# EasyEDA Pro project RK3566_handy_V1.0.epro, schematic RK3566_2, sheets 9 to 13 of 25

## Sheets
9 Power_Charge: Assembly Variant: Basic; Board Name: RK3566主板; Create Date: 2026-09-20; Page Name: P2; Project Name: RK3566手机; Update Date: 2026-09-20
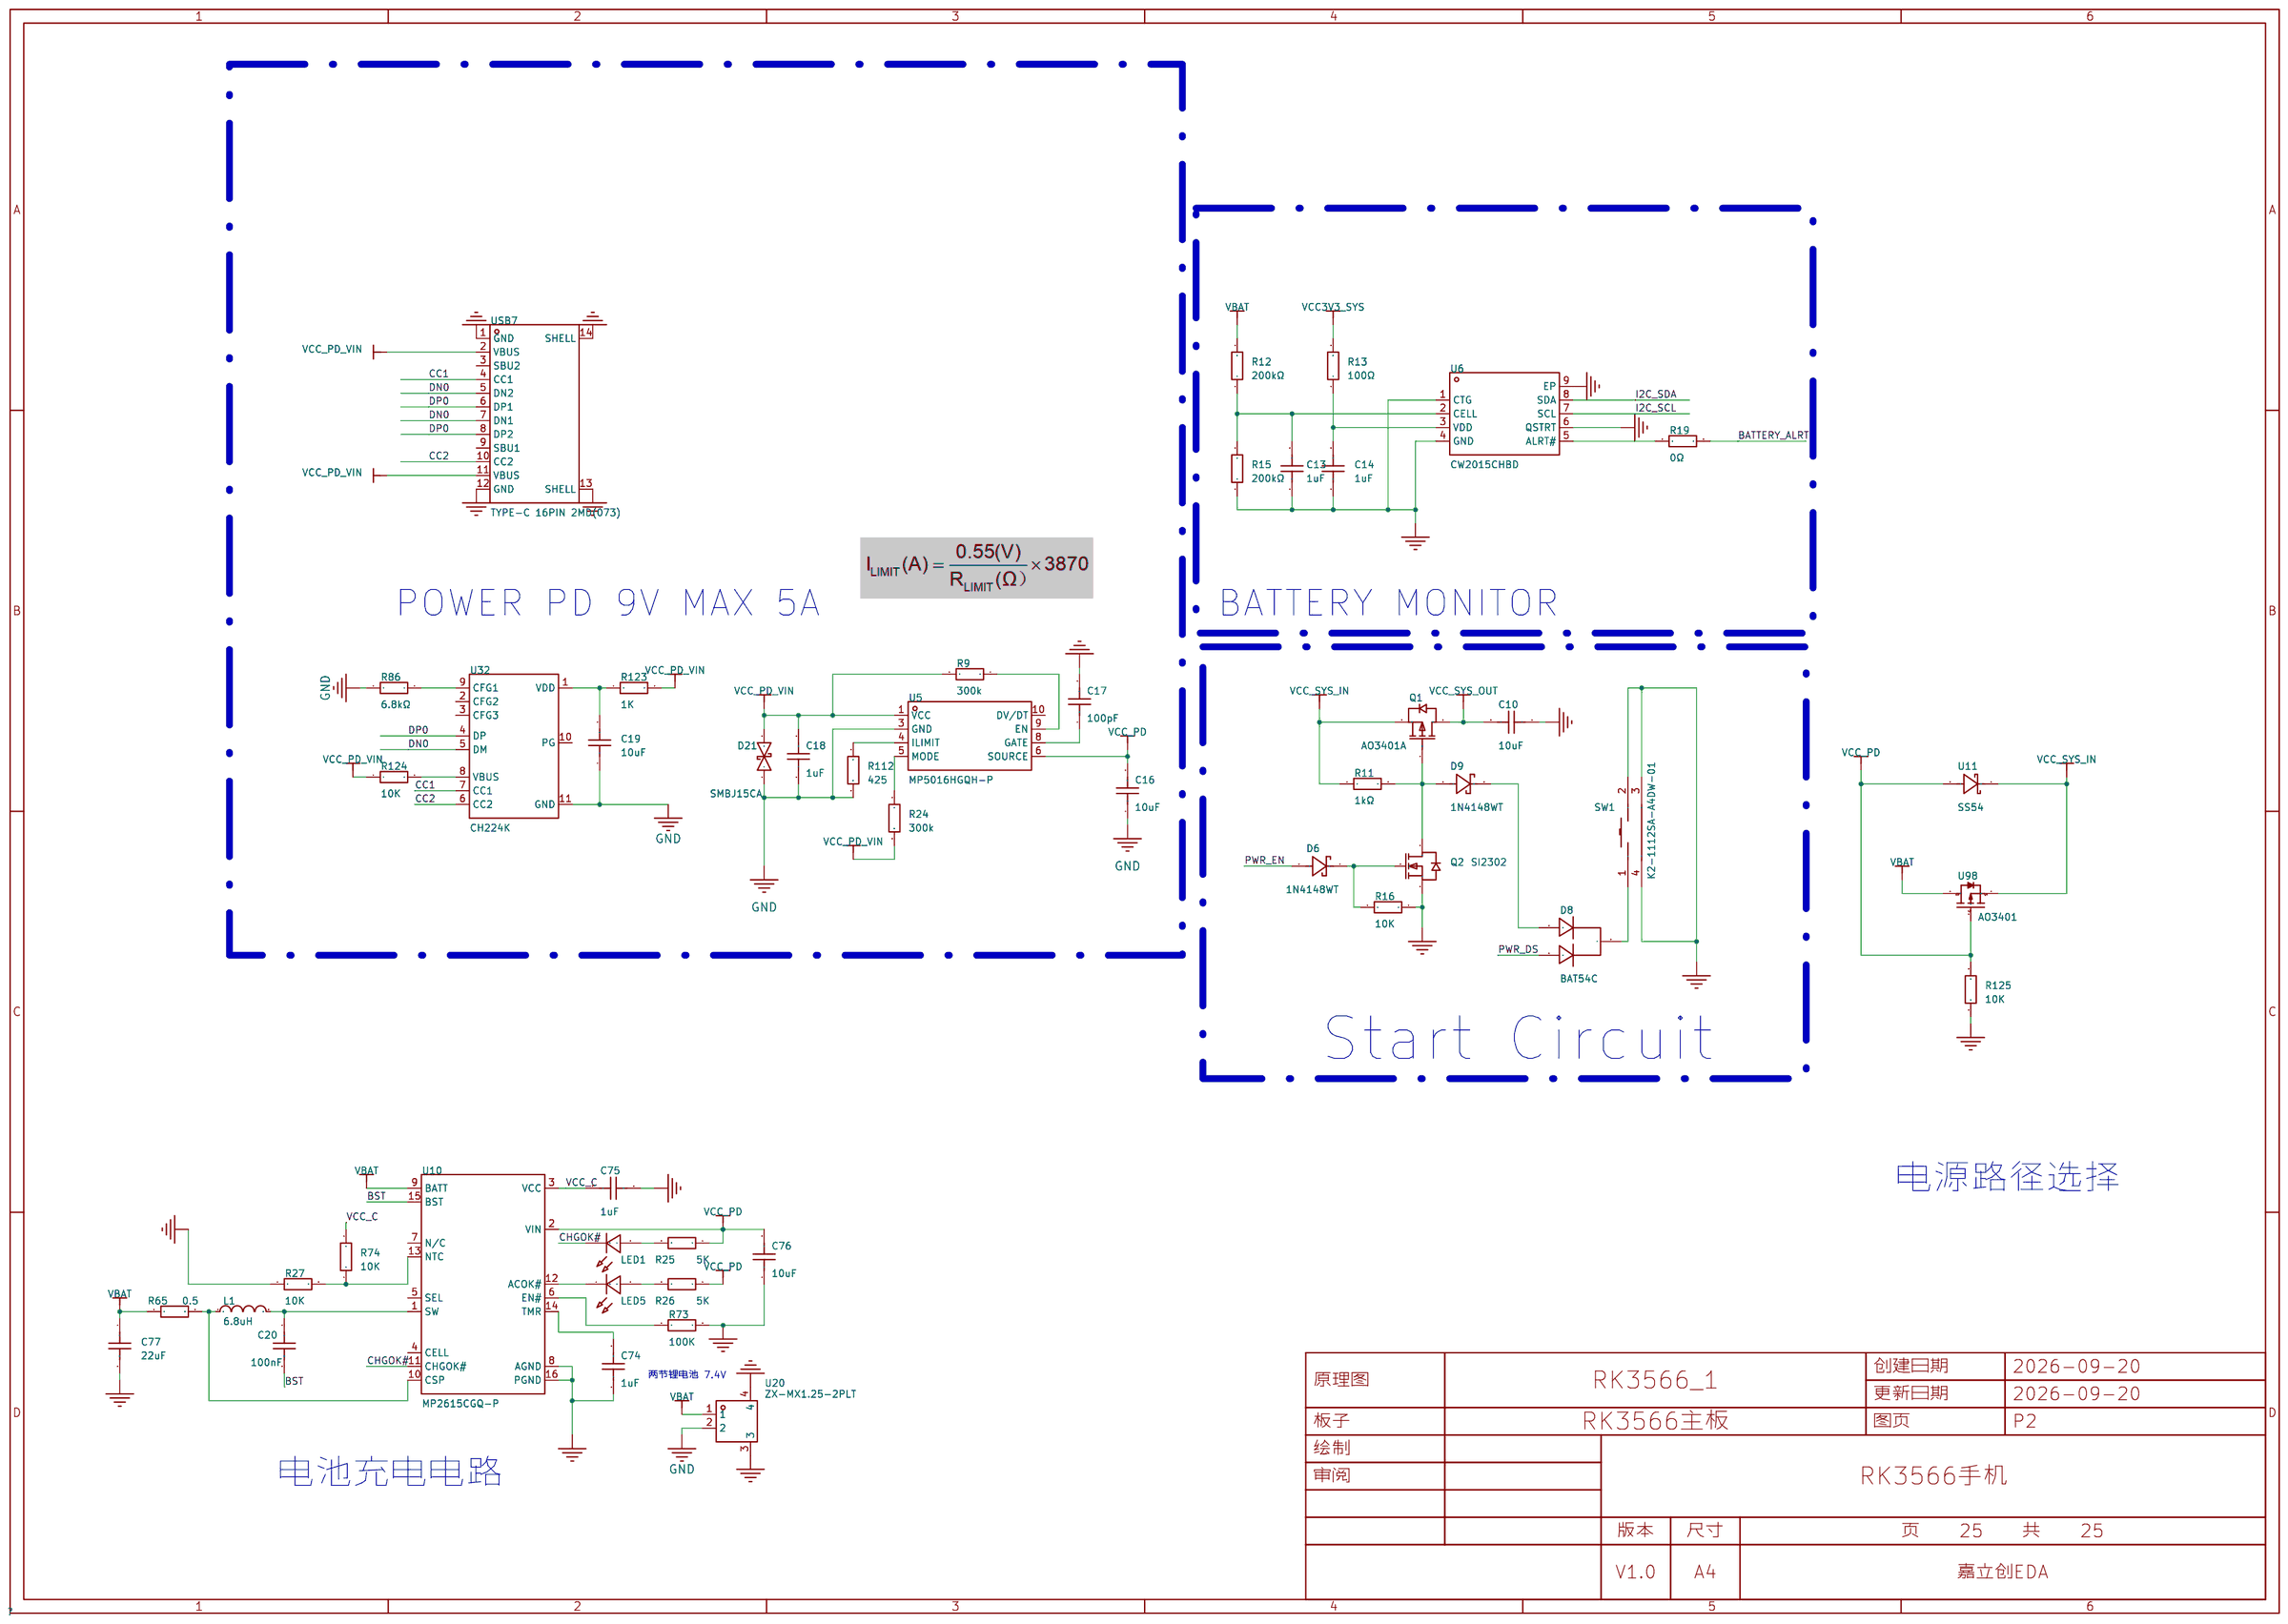
[diagram p8: Power_Charge]
10 MIPI_CSI: Create Date: 2026-09-20; Page Name: MIPI_CSI; Update Date: 2026-09-20
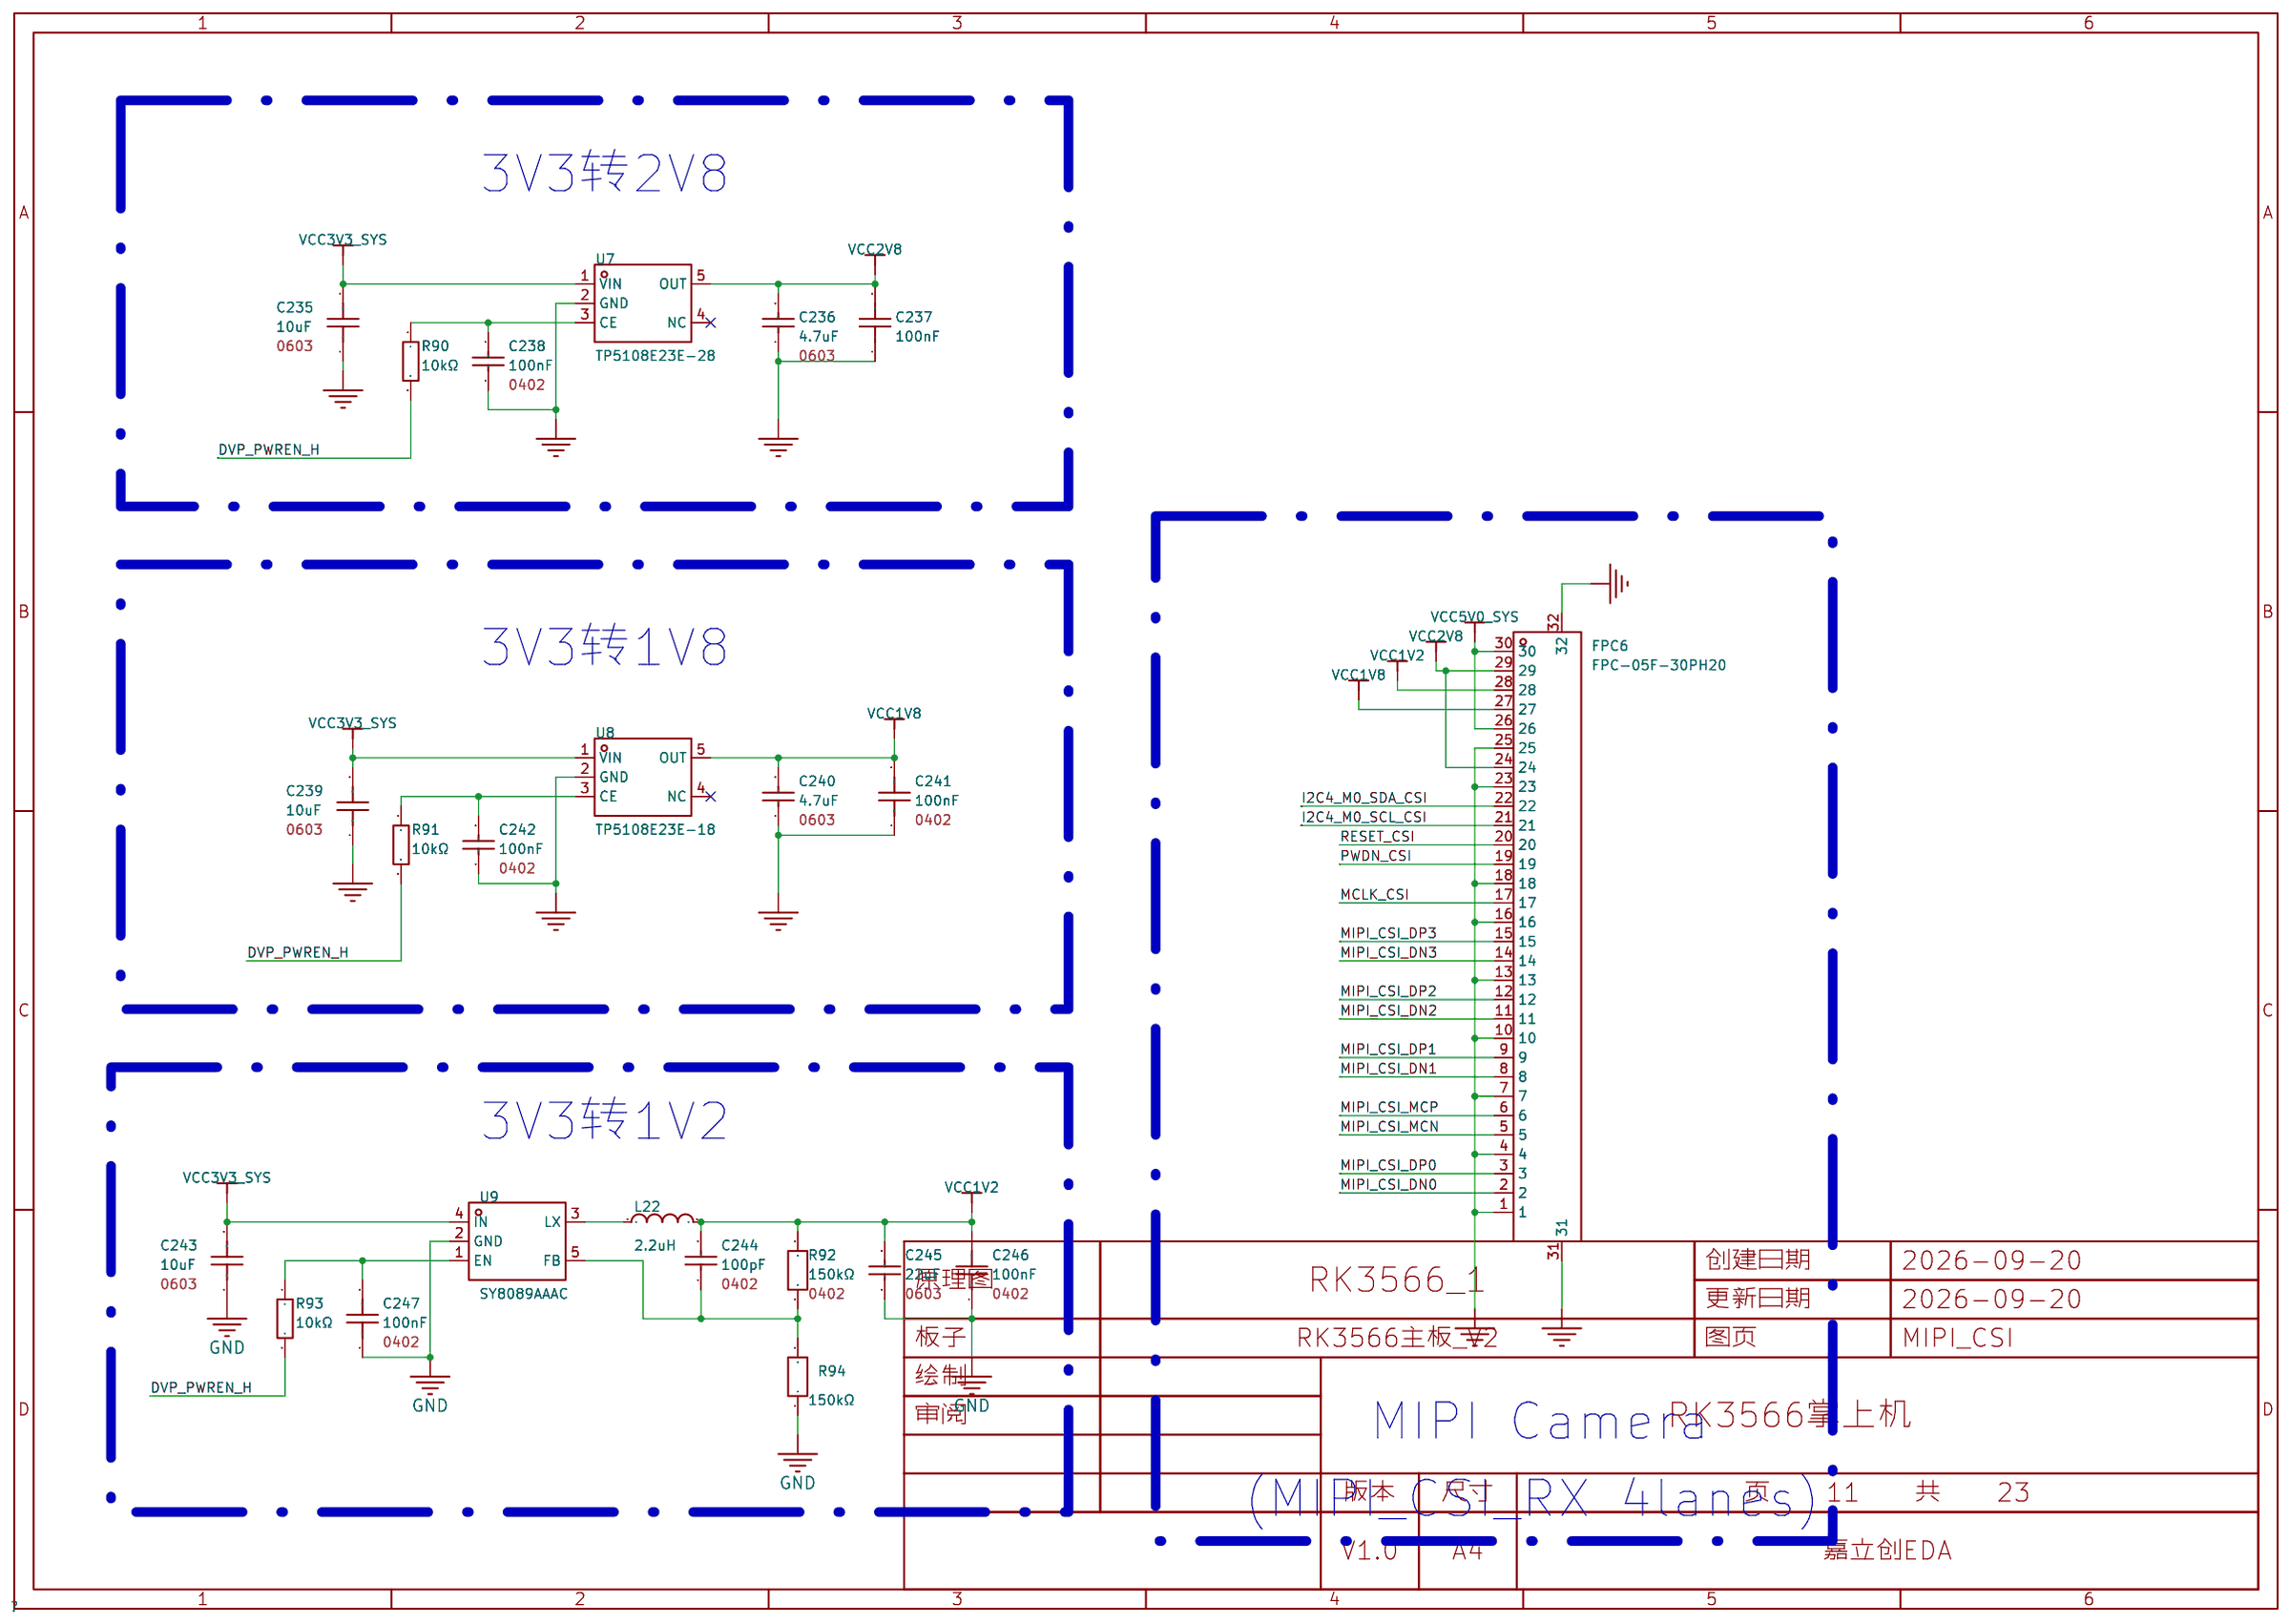
[diagram p9: MIPI_CSI]
11 RK3566_VI INTERFACE: Create Date: 2026-09-20; Page Name: RK3566_VI INTERFACE; Update Date: 2026-09-20
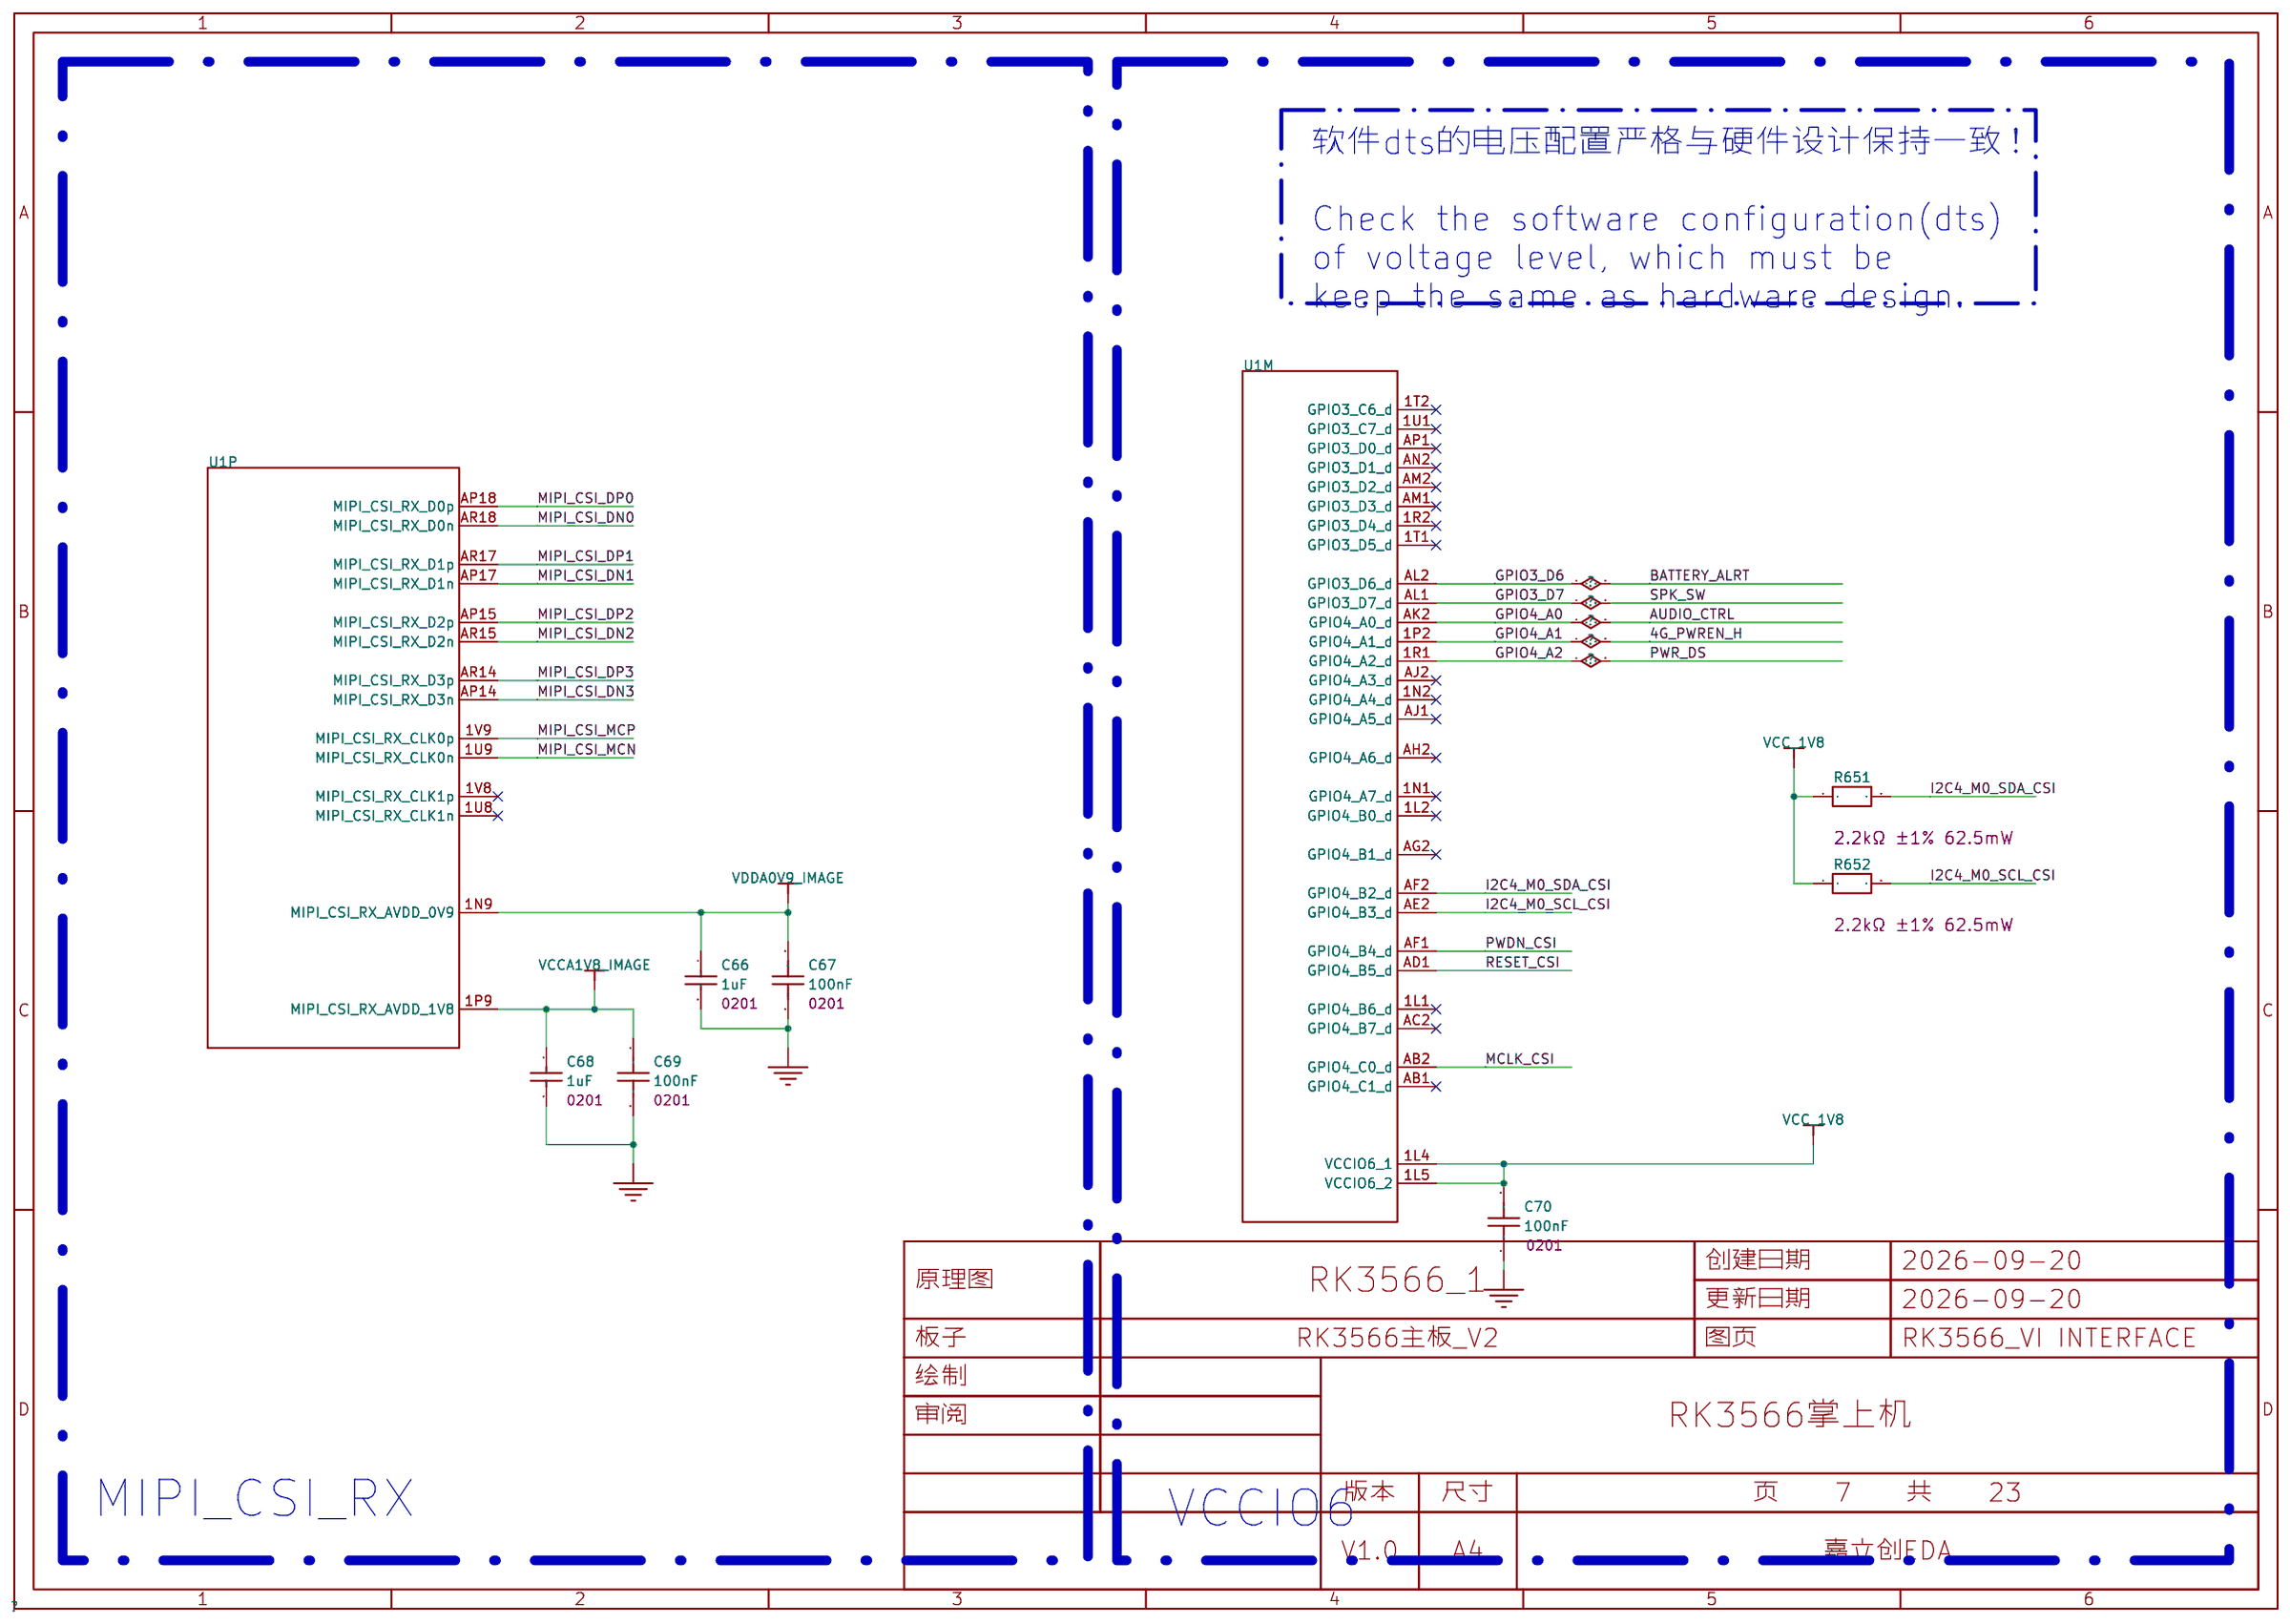
[diagram p10: RK3566_VI INTERFACE]
12 4G: Assembly Variant: Basic; Board Name: RK3566主板; Create Date: 2026-09-20; Page Name: P1; Project Name: RK3566手机; Update Date: 2026-09-20
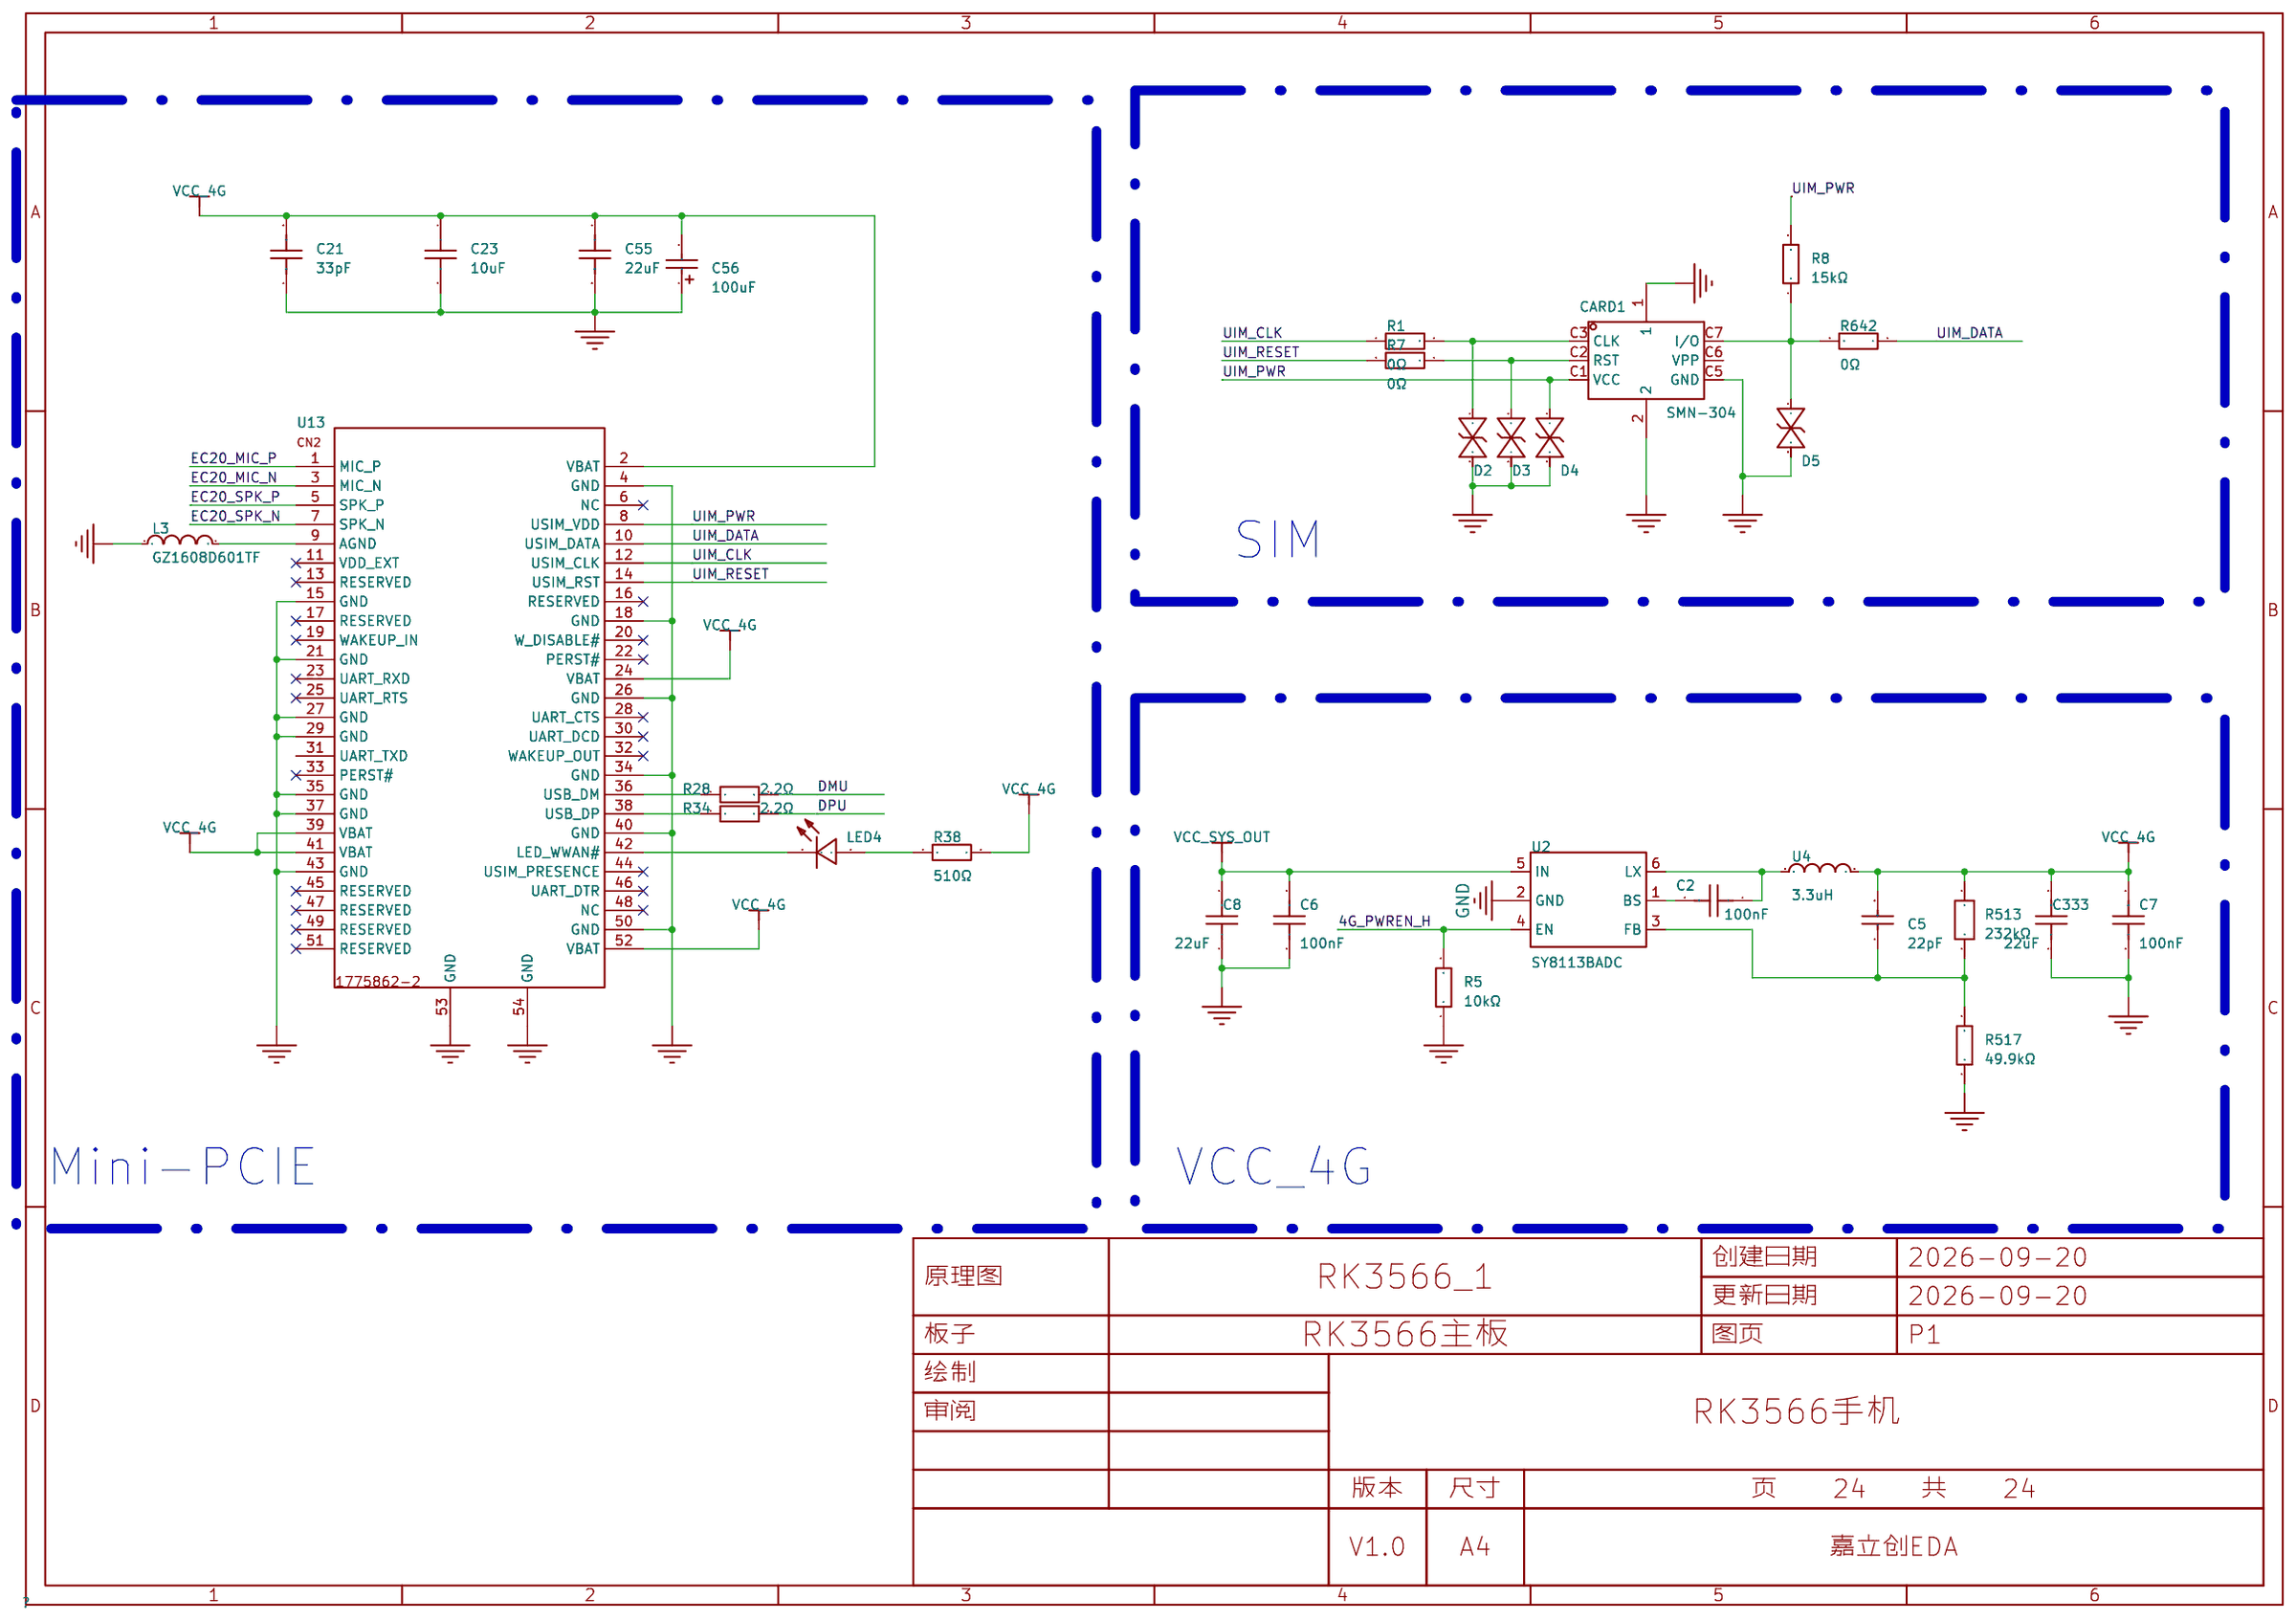
[diagram p11: 4G]
13 RK3566_SARADC/GPIO: Create Date: 2026-09-20; Page Name: RK3566_SARADC/GPIO; Update Date: 2026-09-20
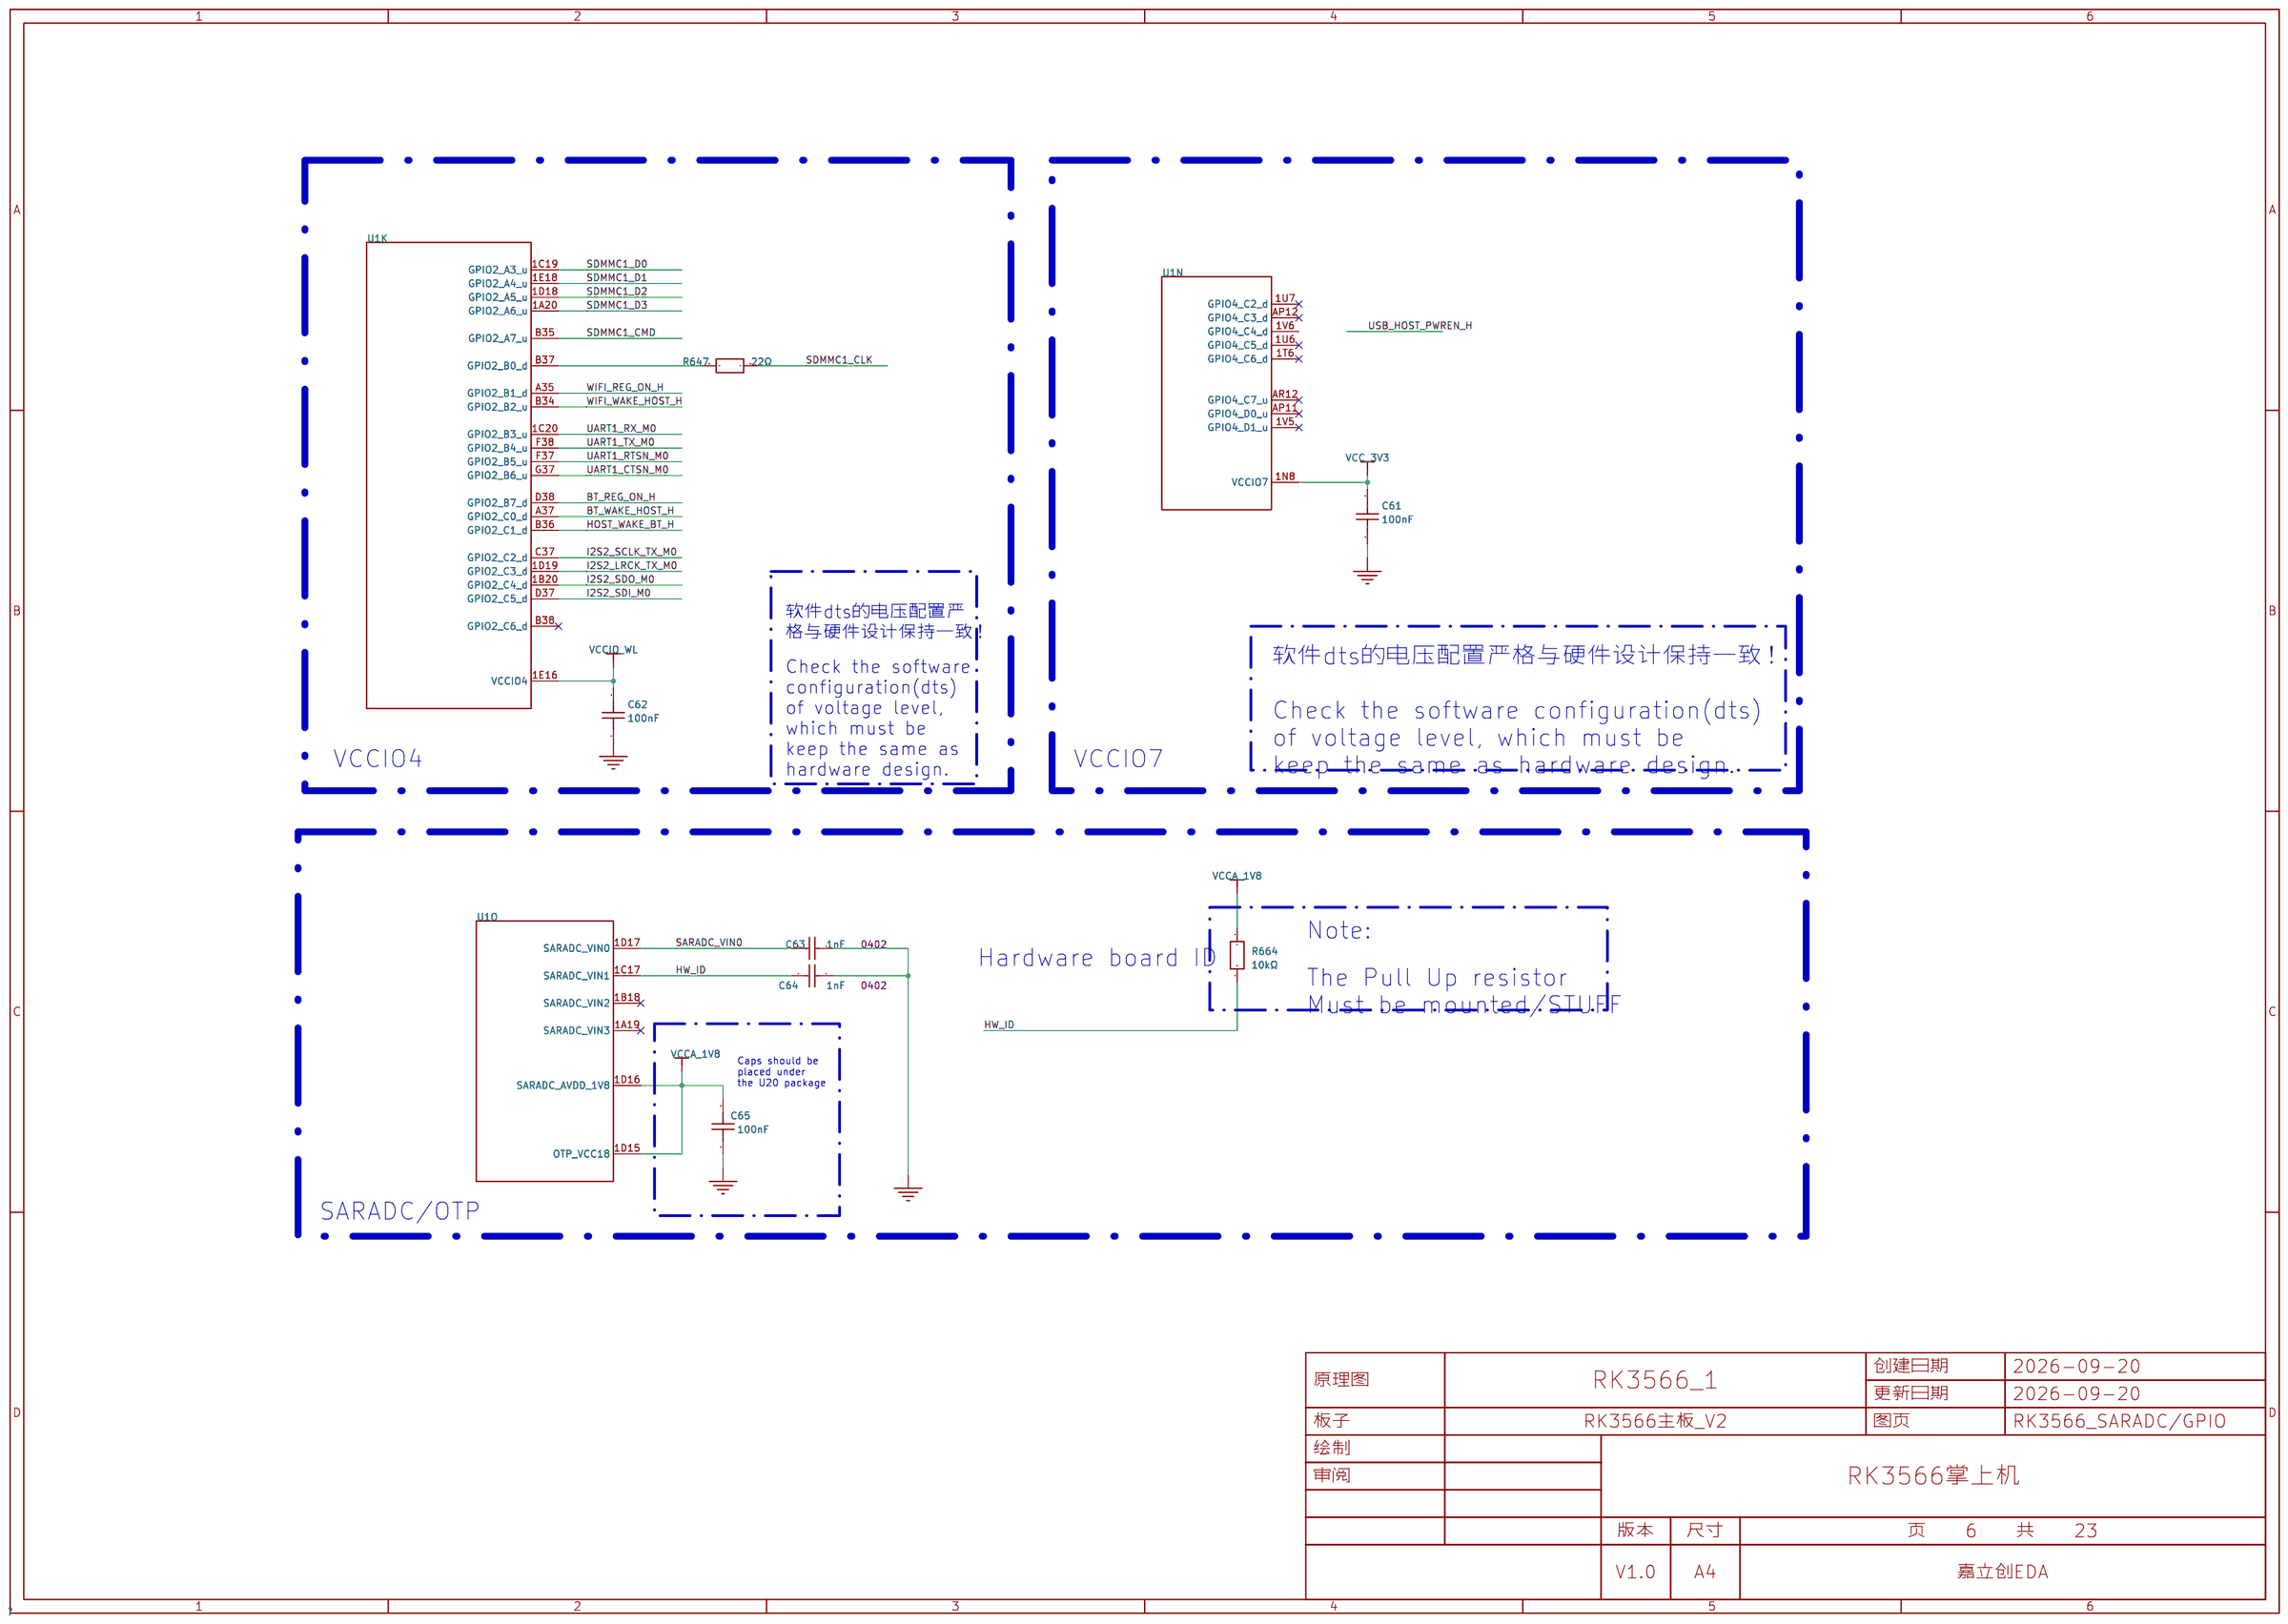
[diagram p12: RK3566_SARADC/GPIO]

## Parts
sheet 4G
C2  100nF  [c0402]
C5  22pF  [c0402]
C6  100nF  [c_0603]
C7  100nF  [c_0603]
C8  22uF  [c_0603]
C21  33pF  [C0402]
C23  10uF  [C0603]
C55  22uF  [C0603]
C56  100uF  [CASE-B_3528]
C333  22uF  [c_0603]
CARD1  SMN-304  [SIM-SMD_SMN-304]
D2  KLXES15AAA1  [r0402]
D3  KLXES15AAA1  [r0402]
D4  KLXES15AAA1  [r0402]
D5  KLXES15AAA1  [r0402]
L3  GZ1608D601TF  [L0603]
LED4  KT-0603B  [LED0603-RD]
R1  0Ω  [r0402]
R5  10kΩ  [r0402]
R7  0Ω  [r0402]
R8  15kΩ  [r0402]
R28  2.2Ω  [r0402]
R34  2.2Ω  [r0402]
R38  510Ω  [r0402]
R513  232kΩ  [r0402]
R517  49.9kΩ  [r0402]
R642  0Ω  [r0402]
U2  SY8113BADC  [TSOT-23-6_L2.9-W1.6-P0.95-LS2.8-BR]
U4  3.3uH  [IND-SMD_L2.5-W2.0]
U13  -  [MINI_PCIE]
sheet MIPI_CSI
C235  10uF  [LL_0603]
C236  4.7uF  [LL_0603]
C237  100nF  [LL_0402]
C238  100nF  [LL_0402]
C239  10uF  [LL_0603]
C240  4.7uF  [LL_0603]
C241  100nF  [LL_0402]
C242  100nF  [LL_0402]
C243  10uF  [LL_0603]
C244  100pF  [LL_0402]
C245  22uF  [LL_0603]
C246  100nF  [LL_0402]
C247  100nF  [LL_0402]
FPC6  FPC-05F-30PH20  [FPC-SMD_30P-P0.50_XUNPU_FPC-05F-30PH20]
L22  2.2uH  [IND-SMD_L2.5-W2.0_MHCHL2520]
R90  10kΩ  [LL_0402]
R91  10kΩ  [LL_0402]
R92  150kΩ  [LL_0402]
R93  10kΩ  [LL_0402]
R94  150kΩ  [LL_0402]
U7  TP5108E23E-28  [SOT-23-5_L3.0-W1.7-P0.95-LS2.8-BL]
U8  TP5108E23E-18  [SOT-23-5_L3.0-W1.7-P0.95-LS2.8-BL]
U9  SY8089AAAC  [SOT-23-5_L3.0-W1.7-P0.95-LS2.8-BR]
sheet Power_Charge
C10  10uF  [C0603]
C13  1uF  [c0402]
C14  1uF  [c0402]
C16  10uF  [C0603]
C17  100pF  [C0603]
C18  1uF  [C0603]
C19  10uF  [C0603]
C20  100nF  [C0603]
C74  1uF  [C0603]
C75  1uF  [C0603]
C76  10uF  [C0603]
C77  22uF  [C0603]
D6  1N4148WT  [SOD-523_L1.2-W0.8-LS1.6-RD]
D8  BAT54C  [SOT-23-3_L2.9-W1.3-P1.90-LS2.4-BR]
D9  1N4148WT  [SOD-523_L1.2-W0.8-LS1.6-RD]
D21  SMBJ15CA  [SMB_L4.6-W3.6-LS5.3-BI]
L1  6.8uH  [IND-SMD_L4.4-W4.2]
LED1  -  [LED_0603]
LED5  -  [LED_0603]
Q1  AO3401A  [SOT-23_L2.9-W1.3-P1.90-LS2.4-BR]
Q2  SI2302  [SOT-23-3_L2.9-W1.3-P1.90-LS2.4-BR]
R9  300k  [R0402]
R11  1kΩ  [R0402]
R12  200kΩ  [r0402]
R13  100Ω  [r0402]
R15  200kΩ  [r0402]
R16  10K  [R0402]
R19  0Ω  [r0402]
R24  300k  [R0402]
R25  5K  [R0603_1]
R26  5K  [R0603_1]
R27  10K  [R0603_1]
R65  0.5  [R1206]
R73  100K  [R0603_1]
R74  10K  [R0603_1]
R86  6.8kΩ  [R0402]
R112  425  [R0402]
R123  1K  [R0603]
R124  10K  [R0603]
R125  10K  [R0603]
SW1  K2-1112SA-A4DW-01  [KEY-TH_K2-1112SA-AXXW-XX]
U5  MP5016HGQH-P  [QFN-10_L2.0-W1.5-P0.5-BL_MP5016HGLH-Z]
U6  CW2015CHBD  [TDFN-8_L3.0-W2.0-P0.50-BL-EP]
U10  MP2615CGQ-P  [QFN-16_L3.0-W3.0-P0.5-BL_MP2615CGQ-P]
U11  SS54  [SMA_L4.2-W2.6-LS5.1-RD]
U20  ZX-MX1.25-2PLT  [CONN-SMD_2P-P1.25-MX1.25-2P-LT]
U32  CH224K  [ESSOP-10_L4.9-W3.9-P1.0-LS6.0-TL-EP]
U98  AO3401  [SOT-23-3_L2.9-W1.6-P1.90-LS2.8-BR]
USB7  TYPE-C 16PIN 2MD(073)  [USB-C-SMD_TYPE-C-6PIN-2MD-073]
sheet RK3566_POWER
U1  -  [BGA-565_L15.5-W14.4-P0.40_RK3566_1]  (sections 1,10,11,12,13,14,15,16,17,18,19,2,20,21,22,3,4,5,6,7,8,9)
sheet RK3566_SARADC/GPIO
C61  100nF  [CC_0201]
C62  100nF  [CC_0201]
C63  1nF  [CC0402]
C64  1nF  [CC0402]
C65  100nF  [CC_0201]
R647  22Ω  [LL_0402]
R664  10kΩ  [RR_0201]
sheet RK3566_VI INTERFACE
C66  1uF  [CC_0201]
C67  100nF  [CC_0201]
C68  1uF  [CC_0201]
C69  100nF  [CC_0201]
C70  100nF  [CC_0201]
R651  2.2kΩ  [RR_0402]
R652  2.2kΩ  [RR_0402]

## Library data of the parts
C2 C237 C241 = CL05B104KB54PNC: 容值:100nF;精度:±10%;额定电压:50V;温度系数:X7R;; LCSC Part Name: 100nF ±10% 50V; Supplier Part: C307331; Manufacturer: SAMSUNG(三星); Supplier Footprint: 0402; JLCPCB Part Class: 基础库; Datasheet: https://item.szlcsc.com/datasheet/CL05B104KB54PNC/291005.html; Supplier: LCSC; Tolerance: ±10%; Voltage Rating: 50V; Temperature Coefficient: X7R; Voltage Rated: 50V
C5 = 0402CG220J500NT: 容值:22pF;精度:±5%;额定电压:50V;材质(温度系数):C0G;; LCSC Part Name: 22pF ±5% 50V; Supplier Part: C1555; Manufacturer: FH(风华); Supplier Footprint: 0402; JLCPCB Part Class: Basic Part; Datasheet: https://atta.szlcsc.com/upload/public/pdf/source/20200305/C486355_26A10D38EF8C2A5C37091D0039909270.pdf; Supplier: LCSC; Tolerance: ±5%; Voltage Rated: 50V; Temperature Coefficient: C0G
C6 C7 = CC0603KRX7R9BB104: 容值:100nF;精度:±10%;额定电压:50V;材质(温度系数):X7R;; LCSC Part Name: 100nF ±10% 50V; Supplier Part: C14663; Manufacturer: YAGEO(国巨); Supplier Footprint: 0603; JLCPCB Part Class: Basic Part; Datasheet: https://atta.szlcsc.com/upload/public/pdf/source/20170116/1484561234239.pdf; Supplier: LCSC; Tolerance: ±10%; Voltage Rated: 50V; Temperature Coefficient: X7R
C8 C245 C333 = CL10A226MQ8NRNC: 容值:22uF;精度:±20%;额定电压:6.3V;材质(温度系数):X5R;; LCSC Part Name: 22uF ±20% 6.3V; Supplier Part: C59461; Manufacturer: SAMSUNG(三星); Supplier Footprint: 0603; JLCPCB Part Class: Basic Part; Datasheet: https://atta.szlcsc.com/upload/public/pdf/source/20160103/1457707740762.pdf; Supplier: LCSC; Tolerance: ±20%; Voltage Rated: 6.3V; Temperature Coefficient: X5R
C21 = FCC0402N330J500AT: 容值:33pF;精度:±5%;额定电压:50V;温度系数:C0G;; LCSC Part Name: 33pF ±5% 50V; Supplier Part: C5137486; Manufacturer: FOJAN(富捷); Supplier Footprint: 0402; JLCPCB Part Class: Extended Part; Datasheet: https://atta.szlcsc.com/upload/public/pdf/source/20220818/0EB3B7FB2F5648AC16609637FBA7DABE.pdf; Supplier: LCSC; Tolerance: ±5%; Voltage Rating: 50V; Temperature Coefficient: C0G
C10 C23 = CL10A106KP8NNNC: 容值:10uF;精度:±10%;额定电压:10V;温度系数:X5R;; LCSC Part Name: 10uF ±10% 10V; Supplier Part: C19702; Manufacturer: SAMSUNG(三星); Supplier Footprint: 0603; JLCPCB Part Class: Basic Part; Datasheet: https://item.szlcsc.com/datasheet/CL10A106KP8NNNC/20411.html; Supplier: LCSC; Tolerance: ±10%; Voltage Rated: 10V; Temperature Coefficient: X5R; Voltage Rating: 10V
C55 = CL10A226MP8NUNE: 容值:22uF;精度:±20%;额定电压:10V;温度系数:X5R;; LCSC Part Name: 22uF ±20% 10V; Supplier Part: C86295; Manufacturer: SAMSUNG(三星); Supplier Footprint: 0603; JLCPCB Part Class: Extended Part; Datasheet: https://item.szlcsc.com/datasheet/CL10A226MP8NUNE/87471.html; Supplier: LCSC; Tolerance: ±20%; Voltage Rating: 10V; Temperature Coefficient: X5R
C56 = TAJB107K006RNJ: 容值:100uF;精度:±10%;额定电压:6.3V;等效串联电阻(ESR):1.7Ω@100kHz;; LCSC Part Name: 100uF ±10% 6.3V; Supplier Part: C16133; Manufacturer: Kyocera AVX; Supplier Footprint: CASE-B-3528-21(mm); JLCPCB Part Class: Basic Part; Supplier: LCSC; Tolerance: ±10%; Voltage Rating: 6.3V; Equivalent Series Resistance(ESR): 1.7Ω@100kHz; Operating Temperature: -55℃~+125℃
CARD1 = SMN-304: 卡连接方式:拔插式;卡类型:NanoSIM卡;连接器类型:卡座;本体最大高度:1.35mm;触头材质:-;触头镀层:金;工作温度范围:-40℃~+85℃;焊接温度(最大值):260℃;; LCSC Part Name: 拔插式 NanoSIM卡 卡座; Supplier Part: C266889; Manufacturer: XUNPU(讯普); Supplier Footprint: SMD; JLCPCB Part Class: 扩展库; Datasheet: https://atta.szlcsc.com/upload/public/pdf/source/20210906/008C96EE0BDD3DBC40121ECB56D55849.pdf; Supplier: LCSC; Card Connection Mode: 拔插式; Card Type: NanoSIM卡; Connector Type: 卡座; Body Height (Max): 1.35mm; Contact Plating: 金; Operating Temperature Range: -40℃~+85℃; Welding Temperature (Max): 260℃; Check: false
D2-D5 = KLXES15AAA1: 极性:双向;反向截止电压(Vrwm):5V;钳位电压(Vc)@Ipp:40V;; Supplier Part: C2892490; Manufacturer: KUU; Supplier Footprint: 0402; JLCPCB Part Class: Extended Part; Datasheet: https://atta.szlcsc.com/upload/public/pdf/source/20210908/40FD94D5521B4EF0ED53BC030E77ED53.pdf; Supplier: LCSC; Polarity: 双向; Reverse Stand-Off Voltage (Vrwm): 5V; Clamping Voltage@Ipp: 40V; Check: false
L3 = GZ1608D601TF: 标称阻抗@测试频率:600Ω@100MHz;误差:±25%;直流电阻(RDC):450mΩ;; LCSC Part Name: 单路 0603磁珠 阻抗600Ω@100MHz; Supplier Part: C1002; Manufacturer: Sunlord(顺络); Supplier Footprint: 0603; JLCPCB Part Class: 基础库; Datasheet: https://atta.szlcsc.com/upload/public/pdf/source/20231030/9B6A3E87682CEC1FF6638DFAA81D73FA.pdf; Supplier: LCSC; Impedance @ Frequency: 600Ω@100MHz; Tolerance: ±25%; DC Resistance: 450mΩ; Current Rating: 200mA; Circuits: 1
LED4 = KT-0603B: 灯头类型:1.6mmx0.8mm方形灯头;发光颜色:蓝色;正向压降(Vf):3.1V;功率:100mW;正向电流:5mA;波长:460nm~475nm;二极管配置:独立二极管;透镜颜色:无色透明透镜;色温:-;发光强度:175mcd;发光角度:120°;载带方式:-;工作温度:-40℃~+85℃;; LCSC Part Name: 0603 蓝灯 高亮; Supplier Part: C2288; Manufacturer: KENTO; Supplier Footprint: 0603; JLCPCB Part Class: Extended Part; Datasheet: https://item.szlcsc.com/datasheet/KT-0603B/2661.html; Supplier: LCSC; Lamp Holder Type: 1.6mmx0.8mm方形灯头; Illumination Color: 蓝色; Voltage - Forward(Vf): 3.1V; Power(Watts): 100mW; Forward Current: 5mA; Wavelength - Dominant: 460nm~475nm; Peak Wavelength: 469nm; Diode Configuration: 独立二极管; Lens Color: 无色透明透镜; Luminous Intensity: 175mcd; Viewing Angle: 120°; Operating Temperature: -40℃~+85℃
R1 R7 R642 = RC0402JR-070RL: 电阻类型:厚膜电阻;阻值:0Ω;精度:±5%;功率:62.5mW;工作电压:50V;温度系数:-;; LCSC Part Name: 厚膜电阻 0Ω ±5% 62.5mW; Supplier Part: C60485; Manufacturer: YAGEO(国巨); Supplier Footprint: 0402; JLCPCB Part Class: 扩展库; Datasheet: https://atta.szlcsc.com/upload/public/pdf/source/20170428/1493376821999.pdf; Supplier: LCSC; Type: 厚膜电阻; Tolerance: ±5%; Power(Watts): 62.5mW; Voltage-Supply(Max): 50V; Operating Temperature: -55℃~+155℃
R5 = 0402WGF1002TCE: 电阻类型:厚膜电阻;阻值:10kΩ;精度:±1%;功率:62.5mW;; LCSC Part Name: 10kΩ ±1% 62.5mW; Supplier Part: C25744; Manufacturer: UNI-ROYAL(厚声); Supplier Footprint: 0402; JLCPCB Part Class: 基础库; Datasheet: https://atta.szlcsc.com/upload/public/pdf/source/20200306/C422600_1E6D84923E4A46A82E41ADD87F860B5C.pdf; Supplier: LCSC; Type: 厚膜电阻; Tolerance: ±1%; Power(Watts): 62.5mW; Temperature Coefficient: ±100ppm/℃; Overload Voltage (Max): 50V; Operating Temperature Range: -55℃~+155℃
R8 = RC0402FR-0715KL: 电阻类型:厚膜电阻;阻值:15kΩ;精度:±1%;功率:62.5mW;最大工作电压:50V;温度系数:±100ppm/℃;; LCSC Part Name: 厚膜电阻 15kΩ ±1% 62.5mW; Supplier Part: C114761; Manufacturer: YAGEO(国巨); Supplier Footprint: 0402; JLCPCB Part Class: 扩展库; Datasheet: https://atta.szlcsc.com/upload/public/pdf/source/20180821/C275644_0D56F95EFF785E7D9A1FEF436B37DA78.pdf; Supplier: LCSC; Type: 厚膜电阻; Tolerance: ±1%; Power(Watts): 62.5mW; Overload Voltage (Max): 50V; Temperature Coefficient: ±100ppm/℃; Operating Temperature Range: -55℃~+155℃
R28 R34 = 0402WGF220KTCE: 电阻类型:厚膜电阻;阻值:2.2Ω;精度:±1%;功率:62.5mW;最大工作电压:50V;温度系数:±200ppm/℃;; LCSC Part Name: 2.2Ω ±1% 62.5mW 厚膜电阻; Supplier Part: C25101; Manufacturer: UNI-ROYAL(厚声); Supplier Footprint: 0402; JLCPCB Part Class: 扩展库; Datasheet: https://atta.szlcsc.com/upload/public/pdf/source/20200306/C422600_1E6D84923E4A46A82E41ADD87F860B5C.pdf; Supplier: LCSC; Type: 厚膜电阻; Tolerance: ±1%; Power(Watts): 62.5mW; Overload Voltage (Max): 50V; Temperature Coefficient: ±200ppm/℃; Operating Temperature Range: -55℃~+155℃
R38 = 0402WGF5100TCE: 电阻类型:厚膜电阻;阻值:510Ω;精度:±1%;功率:62.5mW;最大工作电压:50V;温度系数:±100ppm/℃;; LCSC Part Name: 510Ω ±1% 62.5mW 厚膜电阻; Supplier Part: C25123; Manufacturer: UNI-ROYAL(厚声); Supplier Footprint: 0402; JLCPCB Part Class: Basic Part; Datasheet: https://atta.szlcsc.com/upload/public/pdf/source/20200306/C422600_1E6D84923E4A46A82E41ADD87F860B5C.pdf; Supplier: LCSC; Type: 厚膜电阻; Tolerance: ±1%; Power(Watts): 62.5mW; Overload Voltage (Max): 50V; Temperature Coefficient: ±100ppm/℃; Operating Temperature Range: -55℃~+155℃; Check: false
R513 = FRC0402F2323TS: 电阻类型:厚膜电阻;阻值:232kΩ;精度:±1%;功率:62.5mW;工作电压:50V;温度系数:±100ppm/℃;; LCSC Part Name: 232kΩ ±1% 62.5mW 厚膜电阻; Supplier Part: C3013159; Manufacturer: FOJAN(富捷); Supplier Footprint: 0402; JLCPCB Part Class: 扩展库; Supplier: LCSC; Type: 厚膜电阻; Tolerance: ±1%; Power(Watts): 62.5mW; Voltage-Supply(Max): 50V; Temperature Coefficient: ±100ppm/℃; Operating Temperature: -55℃~+155℃
R517 = 0402WGF4992TCE: 电阻类型:厚膜电阻;阻值:49.9kΩ;精度:±1%;功率:62.5mW;工作电压:50V;温度系数:±100ppm/℃;; LCSC Part Name: 49.9kΩ ±1% 62.5mW 厚膜电阻; Supplier Part: C25897; Manufacturer: UNI-ROYAL(厚声); Supplier Footprint: 0402; JLCPCB Part Class: 扩展库; Datasheet: https://item.szlcsc.com/datasheet/0402WGF4992TCE/26640.html; Supplier: LCSC; Type: 厚膜电阻; Tolerance: ±1%; Power(Watts): 62.5mW; Voltage-Supply(Max): 50V; Temperature Coefficient: ±100ppm/℃; Operating Temperature: -55℃~+155℃
U2 = SY8113BADC: 功能类型:降压型;输出类型:可调;工作电压:4.5V~18V;输出电压:-;输出电流:3A;; LCSC Part Name: 高效率500kHz 3A 18V输入同步降压转换器; Supplier Part: C78989; Manufacturer: Silergy(矽力杰); Supplier Footprint: TSOT-23-6; JLCPCB Part Class: 扩展库; Datasheet: https://item.szlcsc.com/datasheet/SY8113BADC/80126.html; Supplier: LCSC; Function: 降压型; Output Type: 可调; Voltage - Supply: 4.5V~18V; Output Current: 3A; Frequency - Switching: 500kHz; Operating Temperature: -40℃~+125℃@(TJ); Synchronous Rectifier: 是; Number of Outputs: 1; Topology: 降压式; Quiescent Current: 100uA; Switch tube (built-in/external): 内置; Input Voltage: 4.5V~18V; Switching Frequency: 500kHz; Synchronous Rectification: 是; Quiescent Current (Iq): 100uA
U4 = FTC252012S3R3MBCA: 电感值:3.3uH;精度:±20%;额定电流:2.3A;饱和电流(Isat):3A;类型:-;; LCSC Part Name: 3.3uH ±20% 3A; Supplier Part: C5832373; Manufacturer: cjiang(长江微电); Supplier Footprint: 1008; JLCPCB Part Class: 扩展库; Datasheet: https://item.szlcsc.com/datasheet/FTC252012S3R3MBCA/6763493.html; Supplier: LCSC; Tolerance: ±20%; Current Rating: 2.3A; Current - Saturation(Isat): 3A; DC Resistance(DCR): 80mΩ
U13 = PCIE
C235 C239 C243 = CL10A106KP8NNNC: 容值:10uF;精度:±10%;额定电压:10V;材质(温度系数):X5R;; LCSC Part Name: 10uF ±10% 10V; Supplier Part: C19702; Manufacturer: SAMSUNG(三星); Supplier Footprint: 0603; JLCPCB Part Class: Basic Part; Datasheet: https://atta.szlcsc.com/upload/public/pdf/source/20160103/1457707703378.pdf; Supplier: LCSC; Tolerance: ±10%; Voltage Rated: 10V; Temperature Coefficient: X5R
C236 C240 = CL10A475KO8NNNC: 容值:4.7uF;精度:±10%;额定电压:16V;温度系数:X5R;; LCSC Part Name: 4.7uF ±10% 16V; Supplier Part: C19666; Manufacturer: SAMSUNG(三星); Supplier Footprint: 0603; JLCPCB Part Class: 基础库; Datasheet: https://item.szlcsc.com/datasheet/CL10A475KO8NNNC/20375.html; Supplier: LCSC; Tolerance: ±10%; Voltage Rating: 16V; Temperature Coefficient: X5R; Voltage Rated: 16V
C238 C242 = CL05B104KO5NNNC: 容值:100nF;精度:±10%;额定电压:16V;材质(温度系数):X7R;; LCSC Part Name: 100nF ±10% 16V; Supplier Part: C1525; Manufacturer: SAMSUNG(三星); Supplier Footprint: 0402; JLCPCB Part Class: 基础库; Datasheet: https://atta.szlcsc.com/upload/public/pdf/source/20160103/1457707674891.pdf; Supplier: LCSC; Tolerance: ±10%; Voltage Rated: 16V; Temperature Coefficient: X7R
C244 = 0402CG101J500NT: 容值:100pF;精度:±5%;额定电压:50V;材质(温度系数):C0G;; LCSC Part Name: 100pF±5%50V; Supplier Part: C1546; Manufacturer: FH(风华); Supplier Footprint: 0402; JLCPCB Part Class: BasicPart; Datasheet: https://atta.szlcsc.com/upload/public/pdf/source/20170923/C1546_1506149265265988353.pdf; Supplier: LCSC; Tolerance: ±5%; Voltage Rated: 50V; Temperature Coefficient: C0G
C246 C247 = CL05B104KB54PNC: 容值:100nF;精度:±10%;额定电压:50V;温度系数:X7R;; LCSC Part Name: 100nF±10%50V; Supplier Part: C307331; Manufacturer: SAMSUNG(三星); Supplier Footprint: 0402; JLCPCB Part Class: 基础库; Datasheet: https://item.szlcsc.com/datasheet/CL05B104KB54PNC/291005.html; Supplier: LCSC; Tolerance: ±10%; Voltage Rating: 50V; Temperature Coefficient: X7R; Voltage Rated: 50V
FPC6 = FPC-05F-30PH20: 间距:0.5mm;触点数量:30;锁定特性:翻盖式;安装类型:卧贴;触点类型:下接;工作温度范围:-25℃~+85℃;; LCSC Part Name: 0.5mm P数:30 翻盖式 下接; Supplier Part: C2856808; Manufacturer: XUNPU(讯普); Supplier Footprint: SMD,P=0.5mm; JLCPCB Part Class: 扩展库; Datasheet: https://atta.szlcsc.com/upload/public/pdf/source/20210922/C2856808_4E6DDE2793CFD9EF09B771A8BD3338A4.pdf; Supplier: LCSC; Pitch: 0.5mm; Number of Contacts: 30; Locking Feature: 翻盖式; Mounting Type: 卧贴; Contact Type: 下接; Height Above Board: 2mm; FFC, FCB Thickness: 0.3mm; Operating Temperature Range: -25℃~+85℃
L22 = FTC252012S2R2MBCA: 电感值:2.2uH;精度:±20%;额定电流:3A;饱和电流(Isat):3.8A;类型:一体成型电感;; LCSC Part Name: 2.2uH ±20% 3.8A; Supplier Part: C5832372; Manufacturer: cjiang(长江微电); Supplier Footprint: 1008; JLCPCB Part Class: 扩展库; Datasheet: https://atta.szlcsc.com/upload/public/pdf/source/20230602/8FFEDA9C0247A92A0D4B67554BFE4091.pdf; Supplier: LCSC; Tolerance: ±20%; Rated Current: 3A; Saturation Current (Isat): 3.8A; DC Resistance (DCR): 55mΩ; Type: 一体成型电感
R90 R91 = CRCW040210K0FKED: 电阻类型:厚膜电阻;阻值:10kΩ;精度:±1%;功率:63mW;温度系数:±100ppm/K;最大工作电压:50V;工作温度范围:-55℃~+155℃;; LCSC Part Name: 10kΩ ±1% 63mW; Supplier Part: C71617; Manufacturer: VISHAY(威世); Supplier Footprint: 0402; JLCPCB Part Class: 扩展库; Datasheet: https://atta.szlcsc.com/upload/public/pdf/source/20180224/C71617_15194370300791364062.pdf; Supplier: LCSC; Type: 厚膜电阻; Tolerance: ±1%; Power(Watts): 63mW; Temperature Coefficient: ±100ppm/K; Overload Voltage (Max): 50V; Operating Temperature Range: -55℃~+155℃
R92 R94 = ERJ2RKF1503X: 电阻类型:厚膜电阻;阻值:150kΩ;精度:±1%;功率:100mW;温度系数:±100ppm/℃;最大工作电压:-;工作温度范围:-55℃~+155℃;; LCSC Part Name: 150kΩ±1%100mW; Supplier Part: C413108; Manufacturer: PANASONIC(松下); Supplier Footprint: 0402; JLCPCB Part Class: ExtendedPart; Datasheet: https://atta.szlcsc.com/upload/public/pdf/source/20190820/C413108_ED933EFC858348C528DF7AE0A9A6E4FB.pdf; Supplier: LCSC; Type: 厚膜电阻; Tolerance: ±1%; Power(Watts): 100mW; Temperature Coefficient: ±100ppm/℃; Operating Temperature Range: -55℃~+155℃
R93 = CRCW040210K0FKED: 电阻类型:厚膜电阻;阻值:10kΩ;精度:±1%;功率:63mW;温度系数:±100ppm/K;最大工作电压:50V;工作温度范围:-55℃~+155℃;; LCSC Part Name: 10kΩ±1%63mW; Supplier Part: C71617; Manufacturer: VISHAY(威世); Supplier Footprint: 0402; JLCPCB Part Class: 扩展库; Datasheet: https://atta.szlcsc.com/upload/public/pdf/source/20180224/C71617_15194370300791364062.pdf; Supplier: LCSC; Type: 厚膜电阻; Tolerance: ±1%; Power(Watts): 63mW; Temperature Coefficient: ±100ppm/K; Overload Voltage (Max): 50V; Operating Temperature Range: -55℃~+155℃
U7 = TP5108E23E-28: 输出类型:-;; Supplier Part: C907864; Manufacturer: TECH PUBLIC(台舟); Supplier Footprint: SOT-23-5; JLCPCB Part Class: 扩展库; Datasheet: https://atta.szlcsc.com/upload/public/pdf/source/20210810/00BCEBA398DE9B0CD0F512A883B75AB3.pdf; Supplier: LCSC
U8 = TP5108E23E-18: 输出类型:-;; Supplier Part: C907845; Manufacturer: TECH PUBLIC(台舟); Supplier Footprint: SOT-23-5; JLCPCB Part Class: Extended Part; Datasheet: https://atta.szlcsc.com/upload/public/pdf/source/20210810/AA08377C81F8353E2F8C5F8FC160FE00.pdf; Supplier: LCSC
U9 = SY8089AAAC: 功能类型:降压型;同步整流:-;输出通道数:-;拓扑结构:-;输入电压:-;输出电流(最大值):-;开关频率:-;; LCSC Part Name: 降压型; Supplier Part: C78988; Manufacturer: silergy(矽力杰); Supplier Footprint: SOT-23-5; JLCPCB Part Class: Extended Part; Datasheet: https://atta.szlcsc.com/upload/public/pdf/source/20210826/394049C81A2AF57A190C26FDBC282657.pdf; Supplier: LCSC; Function: 降压型
C13 C14 = CL05A105KA5NQNC: 容值:1uF;精度:±10%;额定电压:25V;温度系数:X5R;; LCSC Part Name: 1uF ±10% 25V; Supplier Part: C52923; Manufacturer: SAMSUNG(三星); Supplier Footprint: 0402; JLCPCB Part Class: Basic Part; Datasheet: https://item.szlcsc.com/datasheet/CL05A105KA5NQNC/53938.html; Supplier: LCSC; Tolerance: ±10%; Voltage Rating: 25V; Temperature Coefficient: X5R; Voltage Rated: 25V
C16-C20 C74-C77 = CAP_0603: Supplier Footprint: 0603
D6 D9 = 1N4148WT_C727112: 二极管配置:独立式;正向压降(Vf):1.25V@150mA;直流反向耐压(Vr):75V;平均整流电流(Io):125mA;反向恢复时间(trr):4ns;; LCSC Part Name: 电压:75V 电流:125mA; Supplier Part: C727112; Manufacturer: TWGMC(台湾迪嘉); Supplier Footprint: SOD-523; JLCPCB Part Class: 扩展库; Datasheet: https://atta.szlcsc.com/upload/public/pdf/source/20200828/C727112_FCA71CBB186A515518FBD85DA79D41CF.pdf; Supplier: LCSC; Diode Configuration: 独立式; Forward Voltage (Vf@If): 1.25V@150mA; Reverse Voltage (Vr): 75V; Average Rectified Current (Io): 125mA; Reverse Leakage Current: 1uA@75V; Reverse Recovery Time (trr): 4ns; Operating Temperature: -65℃~+150℃@(Tj)
D8 = BAT54C: Supplier Part: C9900013520; Supplier Footprint: SOT-23; Supplier: LCSC
D21 = SMBJ15CA: 反向截止电压(Vrwm):15V;钳位电压:24.4V;峰值脉冲电流(Ipp):24.6A;击穿电压:16.7V;; Supplier Part: C330064; Manufacturer: JJW(捷捷微); Supplier Footprint: SMB; JLCPCB Part Class: 扩展库; Datasheet: https://atta.szlcsc.com/upload/public/pdf/source/20181224/C338783_C30EB8BBB8C528D881F4F6A96936F798.pdf; Supplier: LCSC; Reverse Stand-Off Voltage (Vrwm): 15V; Clamping Voltage: 24.4V; Peak Pulse Current (Ipp): 24.6A; Voltage - Breakdown: 16.7V; Type: TVS
L1 = FXL0420-6R8-M: 电感值:6.8uH;精度:±20%;额定电流:2.4A;饱和电流(Isat):2.5A;; LCSC Part Name: 6.8uH ±20% 2.5A; Supplier Part: C177241; Manufacturer: cjiang(长江微电); Supplier Footprint: SMD,4.2x4.4mm; JLCPCB Part Class: 扩展库; Datasheet: https://atta.szlcsc.com/upload/public/pdf/source/20190322/C177241_926E0DC8333CBC0DC90F3B0802D0087D.pdf; Supplier: LCSC; Tolerance: ±20%; Rated Current: 2.4A; Saturation Current (Isat): 2.5A; DC Resistance (DCR): 160mΩ
LED1 = LED_0603-G: Supplier Footprint: 0603
LED5 = LED_0603-B: Supplier Footprint: 0603
Q1 = AO3401A_C15127: 数量:1个P沟道;漏源电压(Vdss):30V;连续漏极电流(Id):4A;导通电阻(RDS(on)):47mΩ@10V；85mΩ@2.5V；60mΩ@4.5V;耗散功率(Pd):-;阈值电压(Vgs(th)):900mV@250uA;; LCSC Part Name: 1个P沟道 耐压:30V 电流:4A; Supplier Part: C15127; Manufacturer: AOS; Supplier Footprint: SOT-23; JLCPCB Part Class: Basic Part; Datasheet: https://item.szlcsc.com/datasheet/AO3401A/15801.html; Supplier: LCSC; Drain Source Voltage (Vdss): 30V; Continuous Drain Current (Id): 4A; Power Dissipation (Pd): 1.4W; Drain Source On Resistance (RDS(on)@Vgs,Id): 44mΩ@10V,4.3A; Gate Threshold Voltage (Vgs(th)@Id): 1.3V@250uA; Total Gate Charge (Qg@Vgs): 12.2nC@4.5V; Input Capacitance (Ciss@Vds): 1.2nF@15V; Number: 1个P沟道; Drain to Source Voltage: 30V; Current - Continuous Drain(Id): 4A; RDS(on): 47mΩ@10V；85mΩ@2.5V；60mΩ@4.5V; Gate Threshold Voltage (Vgs(th)): 900mV@250uA; Gate Charge(Qg): 14nC@10V; Input Capacitance(Ciss): 645pF; Reverse Transfer Capacitance (Crss@Vds): 55pF; Output Capacitance(Coss): 80pF
Q2 = SI2302: 类型:N沟道;漏源电压(Vdss):20V;连续漏极电流(Id):2.6A;功率(Pd):900mW;导通电阻(RDS(on)@Vgs,Id):85mΩ@4.5V,2.6A;阈值电压(Vgs(th)@Id):1.5V@250uA;栅极电荷(Qg@Vgs):-;输入电容(Ciss@Vds):880pF@6V;反向传输电容(Crss@Vds):-;工作温度:+150℃@(Tj);; LCSC Part Name: N沟道 20V 2.6A; Supplier Part: C2841377; Manufacturer: TECH PUBLIC(台舟); Supplier Footprint: SOT-23-3; JLCPCB Part Class: 扩展库; Datasheet: https://atta.szlcsc.com/upload/public/pdf/source/20210810/B45106B571BB908B9120BCB1C1283335.pdf; Supplier: LCSC; Type: N沟道; Drain Source Voltage (Vdss): 20V; Continuous Drain Current (Id): 2.6A; Power Dissipation (Pd): 900mW; Drain Source On Resistance (RDS(on)@Vgs,Id): 85mΩ@4.5V,2.6A; Gate Threshold Voltage (Vgs(th)@Id): 1.5V@250uA; Input Capacitance (Ciss@Vds): 880pF@6V; Operating Temperature: +150℃@(Tj)
R9 R16 R24 R112 = Res_0402: Supplier Footprint: 0402
R11 = RC0402FR-07232KL: 电阻类型:厚膜电阻;阻值:232kΩ;精度:±1%;功率:62.5mW;; LCSC Part Name: 232kΩ ±1% 62.5mW; Supplier Part: C309542; Manufacturer: YAGEO(国巨); Supplier Footprint: 0402; JLCPCB Part Class: Extended Part; Datasheet: https://atta.szlcsc.com/upload/public/pdf/source/20181009/C309542_CA3F4488430805647C87B9489F02B718.pdf; Supplier: LCSC; Type: 厚膜电阻; Tolerance: ±1%; Power(Watts): 62.5mW; Temperature Coefficient: ±100ppm/℃; Overload Voltage (Max): 50V; Operating Temperature Range: -55℃~+155℃
R12 R15 = 0402WGF2003TCE: 电阻类型:厚膜电阻;阻值:200kΩ;精度:±1%;功率:62.5mW;最大工作电压:50V;温度系数:±100ppm/℃;; LCSC Part Name: 200kΩ ±1% 62.5mW 厚膜电阻; Supplier Part: C25764; Manufacturer: UNI-ROYAL(厚声); Supplier Footprint: 0402; JLCPCB Part Class: 基础库; Datasheet: https://atta.szlcsc.com/upload/public/pdf/source/20200306/C422600_1E6D84923E4A46A82E41ADD87F860B5C.pdf; Supplier: LCSC; Type: 厚膜电阻; Tolerance: ±1%; Power(Watts): 62.5mW; Overload Voltage (Max): 50V; Temperature Coefficient: ±100ppm/℃; Operating Temperature Range: -55℃~+155℃
R13 = 0402WGF1000TCE: 电阻类型:厚膜电阻;阻值:100Ω;精度:±1%;功率:62.5mW;最大工作电压:50V;温度系数:±200ppm/℃;; LCSC Part Name: 100Ω ±1% 62.5mW 厚膜电阻; Supplier Part: C25076; Manufacturer: UNI-ROYAL(厚声); Supplier Footprint: 0402; JLCPCB Part Class: 基础库; Datasheet: https://atta.szlcsc.com/upload/public/pdf/source/20200306/C422600_1E6D84923E4A46A82E41ADD87F860B5C.pdf; Supplier: LCSC; Type: 厚膜电阻; Tolerance: ±1%; Power(Watts): 62.5mW; Overload Voltage (Max): 50V; Temperature Coefficient: ±200ppm/℃; Operating Temperature Range: -55℃~+155℃
R19 = 0402WGF0000TCE: 电阻类型:厚膜电阻;阻值:0Ω;精度:±1%;功率:62.5mW;; LCSC Part Name: 0Ω ±1% 62.5mW; Supplier Part: C17168; Manufacturer: UNI-ROYAL(厚声); Supplier Footprint: 0402; JLCPCB Part Class: 基础库; Datasheet: https://atta.szlcsc.com/upload/public/pdf/source/20200306/C422600_1E6D84923E4A46A82E41ADD87F860B5C.pdf; Supplier: LCSC; Type: 厚膜电阻; Tolerance: ±1%; Power(Watts): 62.5mW; Temperature Coefficient: ±800ppm/℃; Overload Voltage (Max): 50V; Operating Temperature Range: -55℃~+155℃
R25-R27 R73 R74 = Res_604: Supplier Footprint: 0603
R65 = Res_1206: Supplier Footprint: 1206
R86 = 0402WGF2402TCE: 电阻类型:厚膜电阻;阻值:24kΩ;精度:±1%;功率:62.5mW;最大工作电压:50V;温度系数:±100ppm/℃;; LCSC Part Name: 24kΩ ±1% 62.5mW 厚膜电阻; Supplier Part: C25769; Manufacturer: UNI-ROYAL(厚声); Supplier Footprint: 0402; JLCPCB Part Class: Extended Part; Datasheet: https://atta.szlcsc.com/upload/public/pdf/source/20200306/C422600_1E6D84923E4A46A82E41ADD87F860B5C.pdf; Supplier: LCSC; Type: 厚膜电阻; Tolerance: ±1%; Power(Watts): 62.5mW; Overload Voltage (Max): 50V; Temperature Coefficient: ±100ppm/℃; Operating Temperature Range: -55℃~+155℃
R123-R125 = Res_0603: Supplier Footprint: 0603
SW1 = K2-1112SA-A4DW-01: 作用力:2.5N;安装方式:卧贴;开关长度:7mm;开关宽度:3.5mm;开关高度:3.5mm;触点电流:50mA;额定电压:12V;工作寿命:10万次;; LCSC Part Name: 3*6侧按键高寿命双弹片; Supplier Part: C961745; Manufacturer: 韩国韩荣; Supplier Footprint: SMD,7x3.5mm; JLCPCB Part Class: Extended Part; Datasheet: https://item.szlcsc.com/datasheet/K2-1112SA-A4DW-01/1041850.html; Supplier: LCSC; Operating Force: 2.5N; Mounting Type: 卧贴; Length: 7mm; Width: 3.5mm; Switch Height: 3.5mm; Contact Current: 50mA; Voltage Rating: 12V; Life: 10万次; Operating Temperature: -25℃~+85℃
U5 = MP5016HGQH-P: 通道数:1;输出电流:5A;输入电压:22V;导通电阻:43mΩ;; Supplier Part: C17511186; Manufacturer: MPS(芯源); Supplier Footprint: QFN-10(1.5x2); JLCPCB Part Class: Extended Part; Datasheet: https://atta.szlcsc.com/upload/public/pdf/source/20240129/A0473F64F2AD80E8863A1DB9ED91C917.pdf; Supplier: LCSC; Number of Outputs: 1; Output Current: 5A; Input Voltage: 22V; Resistor On-State: 43mΩ; Operating Temperature	-: -40℃~+125℃
U6 = CW2015CHBD: Supplier Part: C881838; Manufacturer: Cellwise(赛微); Supplier Footprint: TDFN-8-EP(2x3); JLCPCB Part Class: 扩展库; Datasheet: https://atta.szlcsc.com/upload/public/pdf/source/20210512/C881838_09B0689D9538DF441B283DD8D668F2A7.pdf; Supplier: LCSC
U10 = MP2615CGQ-P: 工作电压:18V;最大充电电流:2.1A;电池类型:-;电池节数:1~2;; LCSC Part Name: 2.1A,1-电池或2-电池锂离子电池充电器; Supplier Part: C3682629; Supplier Footprint: QFN-16(3x3); JLCPCB Part Class: Extended Part; Datasheet: https://item.szlcsc.com/datasheet/MP2615CGQ-P/4250434.html; Supplier: LCSC; Voltage - Supply: 18V; Charge Current - Max: 2.1A; Number of Cells: 1~2; Operating Temperature: -40℃~+85℃
U11 = SS54: Supplier Part: C9900023219; Supplier Footprint: (1N5824)DO-214; JLCPCB Part Class: 扩展库; Supplier: LCSC
U20 = ZX-MX1.25-2PLT: 插针结构:1x2P;间距:1.25mm;安装方式:立贴;参考系列:PicoBlade(MX 1.25);总PIN数:2P;排数:1;每排PIN数:2;行距:-;额定电流:1A;触头材质:黄铜;触头镀层:锡;工作温度:-25℃~+85℃;; LCSC Part Name: 1x2P 间距:1.25mm 立贴 系列:PicoBlade(MX 1.25); Supplier Part: C7430473; Manufacturer: Megastar(兆星); Supplier Footprint: SMD,P=1.25mm; JLCPCB Part Class: Extended Part; Datasheet: https://item.szlcsc.com/datasheet/ZX-MX1.25-2PLT/8430342.html; Supplier: LCSC; Pins Structure: 1x2P; Pitch: 1.25mm; Mounting Type: 立贴; Reference Series: PicoBlade(MX 1.25); Number of Pins: 2P; Number of Rows: 1; Number of PINs Per Row: 2; Current Rating: 1A; Contact Material: 黄铜; Contact Plating: 锡; Operating Temperature: -25℃~+85℃; Voltage Rating: 125V; Plastic Material: LCP; Supplementary Features: 辅助焊脚; Color: 米色; Z-Height of the Board: 4.7mm; X-Length of Bottom Edge on Board (Spacing Line): 7.5mm; Y-Width of Bottom Edge on Board: 4.3mm
U32 = CH224K: 应用功能:USB充电芯片;; LCSC Part Name: USB PD等多快充协议受电芯片CH224; Supplier Part: C970725; Manufacturer: WCH(南京沁恒); Supplier Footprint: ESSOP-10-150mil-1mm; JLCPCB Part Class: 扩展库; Datasheet: https://atta.szlcsc.com/upload/public/pdf/source/20240313/43C2AFDDBDD1F65B60386D2CCAB0811B.pdf; Supplier: LCSC; Applications Function: USB充电芯片
U98 = AO3401: Supplier Part: C9900008520; Supplier Footprint: SOT-23; JLCPCB Part Class: 扩展库; Supplier: LCSC
USB7 = TYPE-C 16PIN 2MD(073): 连接器类型:Type-C;协议标准:USB 3.1;公母:母;安装方式:卧贴;触点数量:16P;端口数量:1;额定电流 - 电源:3A;工作温度:-25℃~+85℃;; LCSC Part Name: Type-C 母 卧贴; Supplier Part: C2765186; Manufacturer: SHOU HAN(首韩); Supplier Footprint: SMD; JLCPCB Part Class: 扩展库; Datasheet: https://item.szlcsc.com/datasheet/TYPE-C%252016PIN%25202MD(073)/2901843.html; Supplier: LCSC; Connector Type: Type-C; Protocol Standard: USB 3.1; Gender: 母; Mounting Type: 卧贴; Number of Contacts: 16P; Number of Ports: 1; Current Rating-Power: 3A; Voltage Rating: 5V; Connect-Disconnect Life: 5千次; Detection color: 黑色; Operating Temperature: -25℃~+85℃
U1 = RK3566
C61 C62 C65 C67 C69 C70 = CL03A104KO3NNNC: 容值:100nF;精度:±10%;额定电压:16V;材质(温度系数):X5R;; LCSC Part Name: 100nF ±10% 16V; Supplier Part: C307380; Manufacturer: SAMSUNG(三星); Supplier Footprint: 0201; JLCPCB Part Class: Extended Part; Datasheet: https://atta.szlcsc.com/upload/public/pdf/source/20181009/C307380_E0679AAF9658ADA26DBF30CED0CA6925.pdf; Supplier: LCSC; Tolerance: ±10%; Voltage Rated: 16V; Temperature Coefficient: X5R
C63 C64 = CL05B102KB5NNNC: 容值:1nF;精度:±10%;额定电压:50V;材质(温度系数):X7R;; LCSC Part Name: 1nF ±10% 50V; Supplier Part: C14442; Manufacturer: SAMSUNG(三星); Supplier Footprint: 0402; JLCPCB Part Class: 扩展库; Datasheet: https://atta.szlcsc.com/upload/public/pdf/source/20160103/1457707670498.pdf; Supplier: LCSC; Tolerance: ±10%; Voltage Rated: 50V; Temperature Coefficient: X7R
R647 = 0402WGF220JTCE: 电阻类型:厚膜电阻;阻值:22Ω;精度:±1%;功率:62.5mW;温度系数:±100ppm/℃;; LCSC Part Name: 厚膜电阻 22Ω ±1% 62.5mW; Supplier Part: C25092; Manufacturer: UNI-ROYAL(厚声); Supplier Footprint: 0402; JLCPCB Part Class: Basic Part; Datasheet: https://atta.szlcsc.com/upload/public/pdf/source/20200306/C422600_1E6D84923E4A46A82E41ADD87F860B5C.pdf; Supplier: LCSC; Type: 厚膜电阻; Tolerance: ±1%; Power(Watts): 62.5mW; Temperature Coefficient: ±100ppm/℃; Overload Voltage (Max): 50V; Operating Temperature Range: -55℃~+155℃
R664 = FRC0201J103 TS: 电阻类型:厚膜电阻;阻值:10kΩ;精度:±5%;功率:50mW;温度系数:±200ppm/℃;; LCSC Part Name: 厚膜电阻 10kΩ ±5% 50mW; Supplier Part: C7467266; Manufacturer: FOJAN(富捷); Supplier Footprint: 0201; JLCPCB Part Class: 扩展库; Datasheet: https://item.szlcsc.com/datasheet/FRC0201J103%2520TS/8513882.html; Supplier: LCSC; Type: 厚膜电阻; Tolerance: ±5%; Power(Watts): 50mW; Temperature Coefficient: ±200ppm/℃
C66 C68 = CL03A105MQ3CSNH: 容值:1uF;精度:±20%;额定电压:6.3V;材质(温度系数):X5R;; LCSC Part Name: 1uF ±20% 6.3V; Supplier Part: C53067; Manufacturer: SAMSUNG(三星); Supplier Footprint: 0201; JLCPCB Part Class: Extended Part; Datasheet: https://atta.szlcsc.com/upload/public/pdf/source/20160103/1457707736151.pdf; Supplier: LCSC; Tolerance: ±20%; Voltage Rated: 6.3V; Temperature Coefficient: X5R
R651 R652 = 0402WGF2201TCE: 电阻类型:厚膜电阻;阻值:2.2kΩ;精度:±1%;功率:62.5mW;; LCSC Part Name: 2.2kΩ ±1% 62.5mW; Supplier Part: C25879; Manufacturer: UNI-ROYAL(厚声); Supplier Footprint: 0402; JLCPCB Part Class: Basic Part; Datasheet: https://atta.szlcsc.com/upload/public/pdf/source/20200306/C422600_1E6D84923E4A46A82E41ADD87F860B5C.pdf; Supplier: LCSC; Type: 厚膜电阻; Tolerance: ±1%; Power(Watts): 62.5mW; Temperature Coefficient: ±100ppm/℃; Overload Voltage (Max): 50V; Operating Temperature Range: -55℃~+155℃

## Nets
GND: C6.1 C7.1 C8.1 C10.1 C13.1 C14.1 C16.1 C17.2 C18.1 C19.1 C21.1 C23.2 C55.2 C56.1 C61.1 C62.1 C63.2 C64.2 C65.1 C66.2 C67.1 C68.2 C69.1 C70.1 C74.1 C75.1 C76.1 C77.2 C235.1 C236.1 C237.1 C238.1 C239.1 C240.1 C241.1 C242.1 C243.1 C245.1 C246.1 C247.1 C333.1 CARD1.1 CARD1.2 CARD1.C5(GND) D2.2(A) D3.2(A) D4.2(A) D5.2(A) D21.1(K) FPC6.1 FPC6.4 FPC6.7 FPC6.10 FPC6.13 FPC6.16 FPC6.18 FPC6.23 FPC6.25 FPC6.31 FPC6.32 L3.1 Q2.2(S) R5.1 R15.1 R16.1 R27.1 R73.2 R86.2 R94.1 R112.1 R125.1 R517.1 SW1.2 SW1.3 SW1.4 U2.2(GND) U5.3(GND) U6.1(CTG) U6.4(GND) U6.6(QSTRT) U6.9(EP) U7.2(GND) U8.2(GND) U9.2(GND) U10.8(AGND) U10.16(PGND) U13.4(GND) U13.15(GND) U13.18(GND) U13.21(GND) U13.26(GND) U13.27(GND) U13.29(GND) U13.34(GND) U13.35(GND) U13.37(GND) U13.40(GND) U13.43(GND) U13.50(GND) U13.53(GND) U13.54(GND) U20.2 U20.3 U20.4 U32.11(GND) USB7.1(GND) USB7.12(GND) USB7.13(SHELL) USB7.14(SHELL) ; also on sheet 1 2 3 4 5 6 7 8 14 15 16 17 18 19 20 21 22 23 24 25
VBAT: C77.1 R12.2 R65.1 U10.9(BATT) U20.1 U98.3(D)
VCC1V2: C244.2 C245.2 C246.2 FPC6.28 L22.2 R92.2
VCC1V8: C240.2 C241.2 FPC6.27 U8.5(OUT)
VCC2V8: C236.2 C237.2 FPC6.24 FPC6.29 U7.5(OUT)
VCC3V3_SYS: C235.2 C239.2 C243.2 R13.2 U7.1(VIN) U8.1(VIN) U9.4(IN) ; also on sheet 20 21 22 23
VCC5V0_SYS: FPC6.26 FPC6.30 ; also on sheet 6 7 19 20 21 22
VCC_1V8: C70.2 R651.1 R652.1 U1.1L4(VCCIO6_1) U1.1L5(VCCIO6_2) ; also on sheet 21 22
VCC_3V3: C61.2 U1.1N8(VCCIO7) ; also on sheet 7 8 15 16 17 21 22 25
VCC_4G: C5.2 C7.2 C21.2 C23.1 C55.1 C56.2 C333.2 R38.2 R513.2 U4.2 U13.2(VBAT) U13.24(VBAT) U13.39(VBAT) U13.41(VBAT) U13.52(VBAT)
VCC_C: C75.2 R74.2 U10.3(VCC)
VCC_PD: C16.2 C76.2 R25.1 R26.1 R125.2 U5.6(SOURCE) U10.2(VIN) U11.2(A) U98.1(G)
VCC_PD_VIN: C18.2 D21.2(A) R9.2 R24.2 R123.2 R124.1 U5.1(VCC) USB7.2(VBUS) USB7.11(VBUS)
VCC_SYS_IN: Q1.2(S) R11.1 U11.1(C) U98.2(S)
VCC_SYS_OUT: C6.2 C8.2 C10.2 Q1.3(D) U2.5(IN) ; also on sheet 21
VCCA1V8_IMAGE: C68.1 C69.2 U1.1P9(MIPI_CSI_RX_AVDD_1V8) ; also on sheet 4 22
VCCA_1V8: C65.2 R664.2 U1.1D15(OTP_VCC18) U1.1D16(SARADC_AVDD_1V8) ; also on sheet 8 14 19 22
VCCIO_WL: C62.2 U1.1E16(VCCIO4) ; also on sheet 21 22 23
VDDA0V9_IMAGE: C66.1 C67.2 U1.1N9(MIPI_CSI_RX_AVDD_0V9) ; also on sheet 4 22
4G_PWREN_H: R5.2 U1.1P2(GPIO4_A1_d) U2.4(EN)
AUDIO_CTRL: U1.AK2(GPIO4_A0_d) ; also on sheet 20
BATTERY_ALRT: R19.2 U1.AL2(GPIO3_D6_d)
BST: C20.2 U10.15(BST)
BT_REG_ON_H: U1.D38(GPIO2_B7_d) ; also on sheet 23
BT_WAKE_HOST_H: U1.A37(GPIO2_C0_d) ; also on sheet 23
CC1: U32.7(CC1) USB7.4(CC1)
CC2: U32.6(CC2) USB7.10(CC2)
CHGOK#: LED1.1(C) U10.11(CHGOK#)
DMU: R28.2 ; also on sheet 8
DN0: U32.5(DM) USB7.5(DN2) USB7.7(DN1)
DP0: U32.4(DP) USB7.6(DP1) USB7.8(DP2)
DPU: R34.2 ; also on sheet 8
DVP_PWREN_H: R90.2 R91.2 R93.2 ; also on sheet 14
EC20_MIC_N: U13.3(MIC_N) ; also on sheet 20
EC20_MIC_P: U13.1(MIC_P) ; also on sheet 20
EC20_SPK_N: U13.7(SPK_N) ; also on sheet 20
EC20_SPK_P: U13.5(SPK_P) ; also on sheet 20
GPIO0_A5: D6.2(A) ; also on sheet 14
GPIO3_D7: U1.AL1(GPIO3_D7_d) ; also on sheet 20
GPIO4_A2: D8.2(A2) U1.1R1(GPIO4_A2_d)
HOST_WAKE_BT_H: U1.B36(GPIO2_C1_d) ; also on sheet 23
HW_ID: C64.1 R664.1 U1.1C17(SARADC_VIN1)
I2C1_SCL_TP: U6.8(SDA) ; also on sheet 7 14 17
I2C1_SDA_TP: U6.7(SCL) ; also on sheet 7 14 17
I2C4_M0_SCL_CSI: FPC6.21 R652.2 U1.AE2(GPIO4_B3_d)
I2C4_M0_SDA_CSI: FPC6.22 R651.2 U1.AF2(GPIO4_B2_d)
I2S2_LRCK_TX_M0: U1.1D19(GPIO2_C3_d) ; also on sheet 23
I2S2_SCLK_TX_M0: U1.C37(GPIO2_C2_d) ; also on sheet 23
I2S2_SDI_M0: U1.D37(GPIO2_C5_d) ; also on sheet 23
I2S2_SDO_M0: U1.1B20(GPIO2_C4_d) ; also on sheet 23
MCLK_CSI: FPC6.17 U1.AB2(GPIO4_C0_d)
MIPI_CSI_DN0: FPC6.2 U1.AR18(MIPI_CSI_RX_D0n)
MIPI_CSI_DN1: FPC6.8 U1.AP17(MIPI_CSI_RX_D1n)
MIPI_CSI_DN2: FPC6.11 U1.AR15(MIPI_CSI_RX_D2n)
MIPI_CSI_DN3: FPC6.14 U1.AP14(MIPI_CSI_RX_D3n)
MIPI_CSI_DP0: FPC6.3 U1.AP18(MIPI_CSI_RX_D0p)
MIPI_CSI_DP1: FPC6.9 U1.AR17(MIPI_CSI_RX_D1p)
MIPI_CSI_DP2: FPC6.12 U1.AP15(MIPI_CSI_RX_D2p)
MIPI_CSI_DP3: FPC6.15 U1.AR14(MIPI_CSI_RX_D3p)
MIPI_CSI_MCN: FPC6.5 U1.1U9(MIPI_CSI_RX_CLK0n)
MIPI_CSI_MCP: FPC6.6 U1.1V9(MIPI_CSI_RX_CLK0p)
PWDN_CSI: FPC6.19 U1.AF1(GPIO4_B4_d)
RESET_CSI: FPC6.20 U1.AD1(GPIO4_B5_d)
SARADC_VIN0: C63.1 U1.1D17(SARADC_VIN0) ; also on sheet 19
SDMMC1_CLK: R647.2 ; also on sheet 23
SDMMC1_CMD: U1.B35(GPIO2_A7_u) ; also on sheet 23
SDMMC1_D0: U1.1C19(GPIO2_A3_u) ; also on sheet 23
SDMMC1_D1: U1.1E18(GPIO2_A4_u) ; also on sheet 23
SDMMC1_D2: U1.1D18(GPIO2_A5_u) ; also on sheet 23
SDMMC1_D3: U1.1A20(GPIO2_A6_u) ; also on sheet 23
UART1_CTSN_M0: U1.G37(GPIO2_B6_u) ; also on sheet 23
UART1_RTSN_M0: U1.F37(GPIO2_B5_u) ; also on sheet 23
UART1_RX_M0: U1.1C20(GPIO2_B3_u) ; also on sheet 23
UART1_TX_M0: U1.F38(GPIO2_B4_u) ; also on sheet 23
UIM_CLK: R1.2 U13.12(USIM_CLK)
UIM_DATA: R642.1 U13.10(USIM_DATA)
UIM_PWR: CARD1.C1(VCC) D4.1(K) R8.2 U13.8(USIM_VDD)
UIM_RESET: R7.2 U13.14(USIM_RST)
WIFI_REG_ON_H: U1.A35(GPIO2_B1_d) ; also on sheet 23
WIFI_WAKE_HOST_H: U1.B34(GPIO2_B2_u) ; also on sheet 23
$6N1442: R647.1 U1.B37(GPIO2_B0_d)
$17N1315: C247.2 R93.1 U9.1(EN)
$17N1318: L22.1 U9.3(LX)
$17N1319: C244.1 R92.1 R94.2 U9.5(FB)
$17N1325: C238.2 R90.1 U7.3(CE)
$17N1326: C242.2 R91.1 U8.3(CE)
$25N1: C5.1 R513.1 R517.2 U2.3(FB)
$25N5: C2.1 U2.6(LX) U4.1
$25N6: C2.2 U2.1(BS)
$25N14: CARD1.C7(I/O) D5.1(K) R8.1 R642.2
$25N25: CARD1.C3(CLK) D2.1(K) R1.1
$25N26: CARD1.C2(RST) D3.1(K) R7.1
$25N57: R34.1 U13.38(USB_DP)
$25N58: R28.1 U13.36(USB_DM)
$25N63: L3.2 U13.9(AGND)
$25N65: LED4.2(A) R38.1
$25N66: LED4.1(K) U13.42(LED_WWAN#)
$26N67: R19.1 U6.5(ALRT#)
$26N79: C14.2 R13.1 U6.3(VDD)
$26N80: C13.2 R12.1 R15.2 U6.2(CELL)
$26N94: R24.1 U5.5(MODE)
$26N95: R9.1 U5.9(EN)
$26N99: C17.1 U5.8(GATE)
$26N100: R112.2 U5.4(ILIMIT)
$26N103: C19.2 R123.1 U32.1(VDD)
$26N106: R86.1 U32.9(CFG1)
$26N108: R124.2 U32.8(VBUS)
$26N120: L1.1 R65.2 U10.10(CSP)
$26N121: C20.1 L1.2 U10.1(SW)
$26N126: LED1.2(A) R25.2
$26N128: R27.2 R74.1 U10.13(NTC)
$26N132: C74.2 U10.14(TMR)
$26N134: R73.1 U10.6(EN#)
$26N136: LED5.2(A) R26.2
$26N137: LED5.1(C) U10.12(ACOK#)
$26N171: D6.1(C) Q2.1(G) R16.2
$26N174: D8.1(A1) D9.1(C)
$26N175: D8.3(K) SW1.1
$26N176: D9.2(A) Q1.1(G) Q2.3(D) R11.2

Not connected (* = marked no-connect by the designer): CARD1 C6(VPP); U1 1A19(SARADC_VIN3)* 1B18(SARADC_VIN2)* 1L1(GPIO4_B6_d)* 1L2(GPIO4_B0_d)* 1N1(GPIO4_A7_d)* 1N2(GPIO4_A4_d)* 1R2(GPIO3_D4_d)* 1T1(GPIO3_D5_d)* 1T2(GPIO3_C6_d)* 1T6(GPIO4_C6_d)* 1U1(GPIO3_C7_d)* 1U6(GPIO4_C5_d)* 1U7(GPIO4_C2_d)* 1U8(MIPI_CSI_RX_CLK1n)* 1V5(GPIO4_D1_u)* 1V6(GPIO4_C4_d) 1V8(MIPI_CSI_RX_CLK1p)* AB1(GPIO4_C1_d)* AC2(GPIO4_B7_d)* AG2(GPIO4_B1_d)* AH2(GPIO4_A6_d)* AJ1(GPIO4_A5_d)* AJ2(GPIO4_A3_d)* AM1(GPIO3_D3_d)* AM2(GPIO3_D2_d)* AN2(GPIO3_D1_d)* AP1(GPIO3_D0_d)* AP11(GPIO4_D0_u)* AP12(GPIO4_C3_d)* AR12(GPIO4_C7_u)* B38(GPIO2_C6_d)*; U5 10(DV/DT); U7 4(NC)*; U8 4(NC)*; U10 4(CELL) 5(SEL) 7(N/C); U13 6(NC)* 11(VDD_EXT)* 13(RESERVED)* 16(RESERVED)* 17(RESERVED)* 19(WAKEUP_IN)* 20(W_DISABLE#)* 22(PERST#)* 23(UART_RXD)* 25(UART_RTS)* 28(UART_CTS)* 30(UART_DCD)* 31(UART_TXD) 32(WAKEUP_OUT)* 33(PERST#)* 44(USIM_PRESENCE)* 45(RESERVED)* 46(UART_DTR)* 47(RESERVED)* 48(NC)* 49(RESERVED)* 51(RESERVED)*; U32 2(CFG2) 3(CFG3) 10(PG); USB7 3(SBU2) 9(SBU1)

## Notes on the sheets
sheet 9
- POWER PD 9V MAX 5A
- BATTERY MONITOR
- Start Circuit
- 电源路径选择
- 两节锂电池 7.4V
- 电池充电电路
sheet 10
- 3V3转2V8
- 3V3转1V8
- 3V3转1V2
- MIPI Camera
- (MIPI_CSI_RX 4lanes)
sheet 11
- 软件dts的电压配置严格与硬件设计保持一致！
- Check the software configuration(dts)
  of voltage level, which must be
  keep the same as hardware design.
- MIPI_CSI_RX
- VCCIO6
sheet 12
- SIM
- Mini-PCIE
- VCC_4G
sheet 13
- 软件dts的电压配置严
  格与硬件设计保持一致！
- Check the software
  configuration(dts)
  of voltage level,
  which must be
  keep the same as
  hardware design.
- 软件dts的电压配置严格与硬件设计保持一致！
- Check the software configuration(dts)
  of voltage level, which must be
  keep the same as hardware design.
- VCCIO4
- VCCIO7
- Note:
- Hardware board ID
- The Pull Up resistor
  Must be mounted/STUFF
- Caps should be
  placed under
  the U20 package
- SARADC/OTP
